# EasyEDA Pro project hardware_project.epro, schematic Schematic4, sheets 1 to 4 of 7

## Sheets
1 ADDA: Board Name: FPGA大赛底板; Create Date: 2026-09-14; Page Name: P1; Project Name: 高速DAC; Schematic Name: Schematic4; Update Date: 2026-09-14; Company: 嘉立创EDA; Drawed: 杨佳乐; Page Size: A4; Version: V1.0
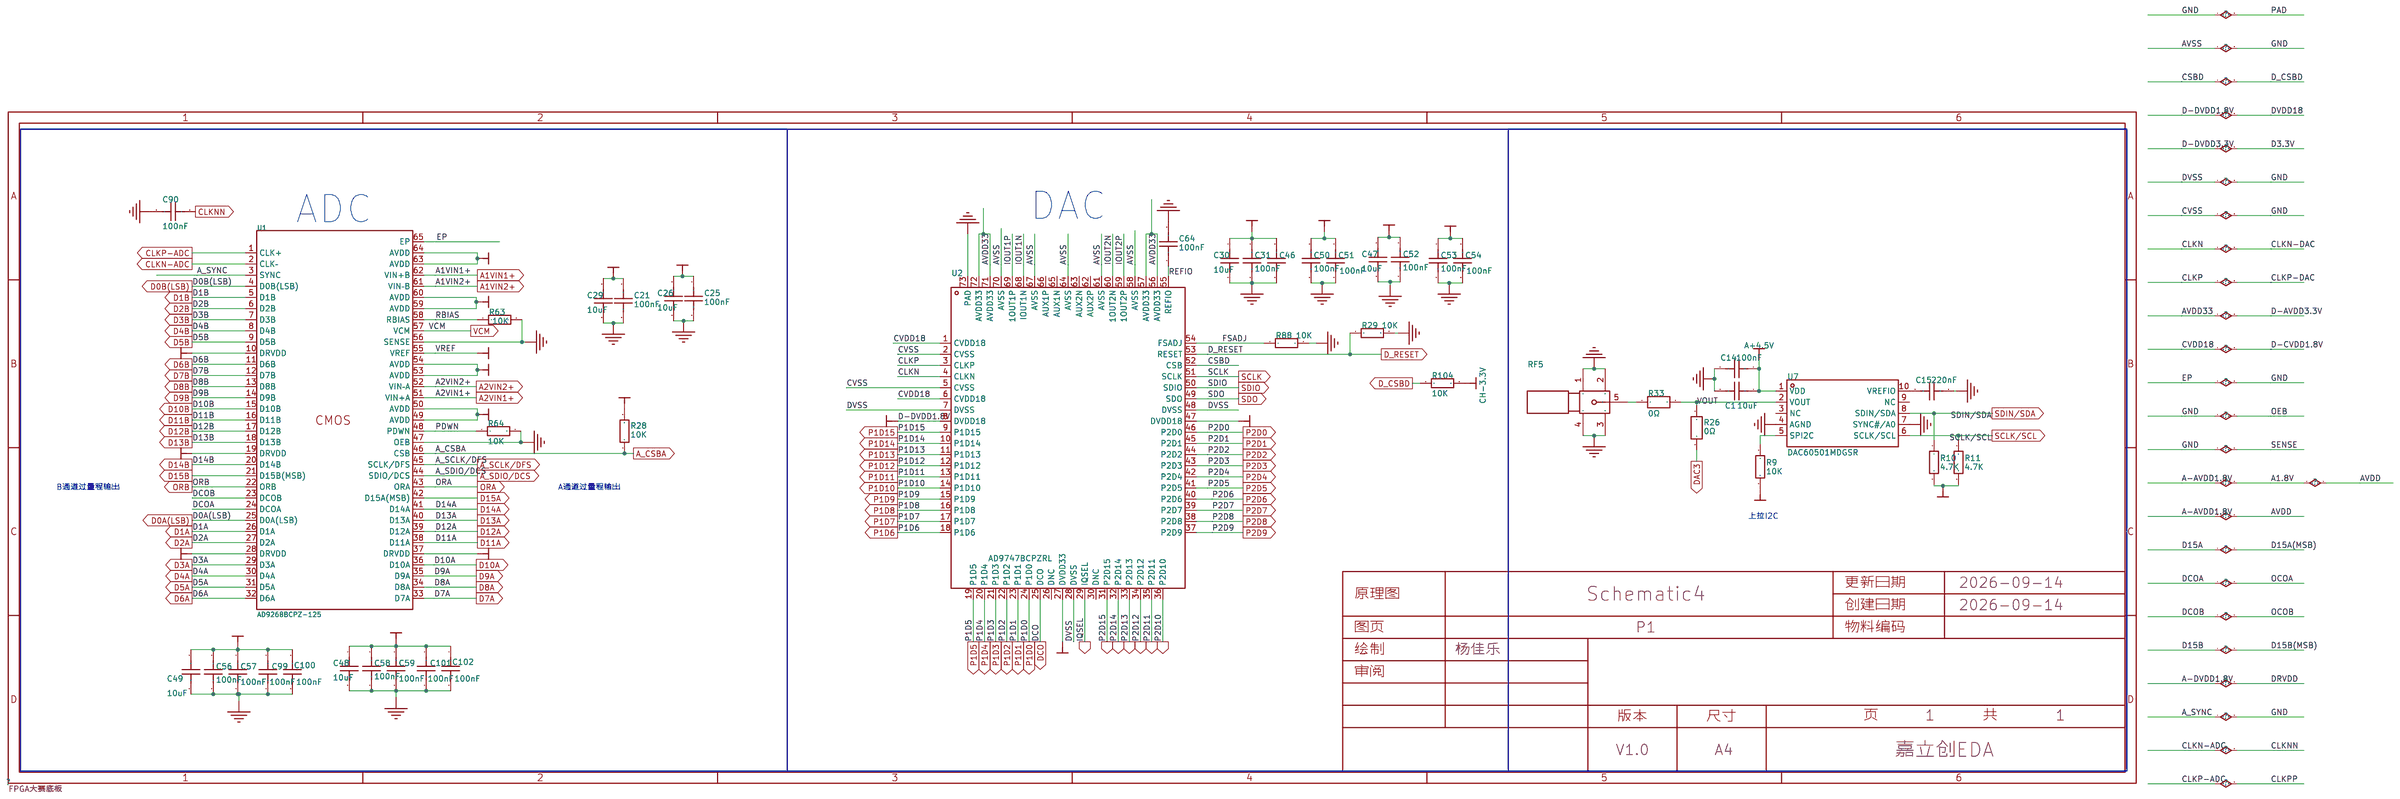
[diagram p0: ADDA]
2 框架: Create Date: 2026-10-14; Update Date: 2026-10-14
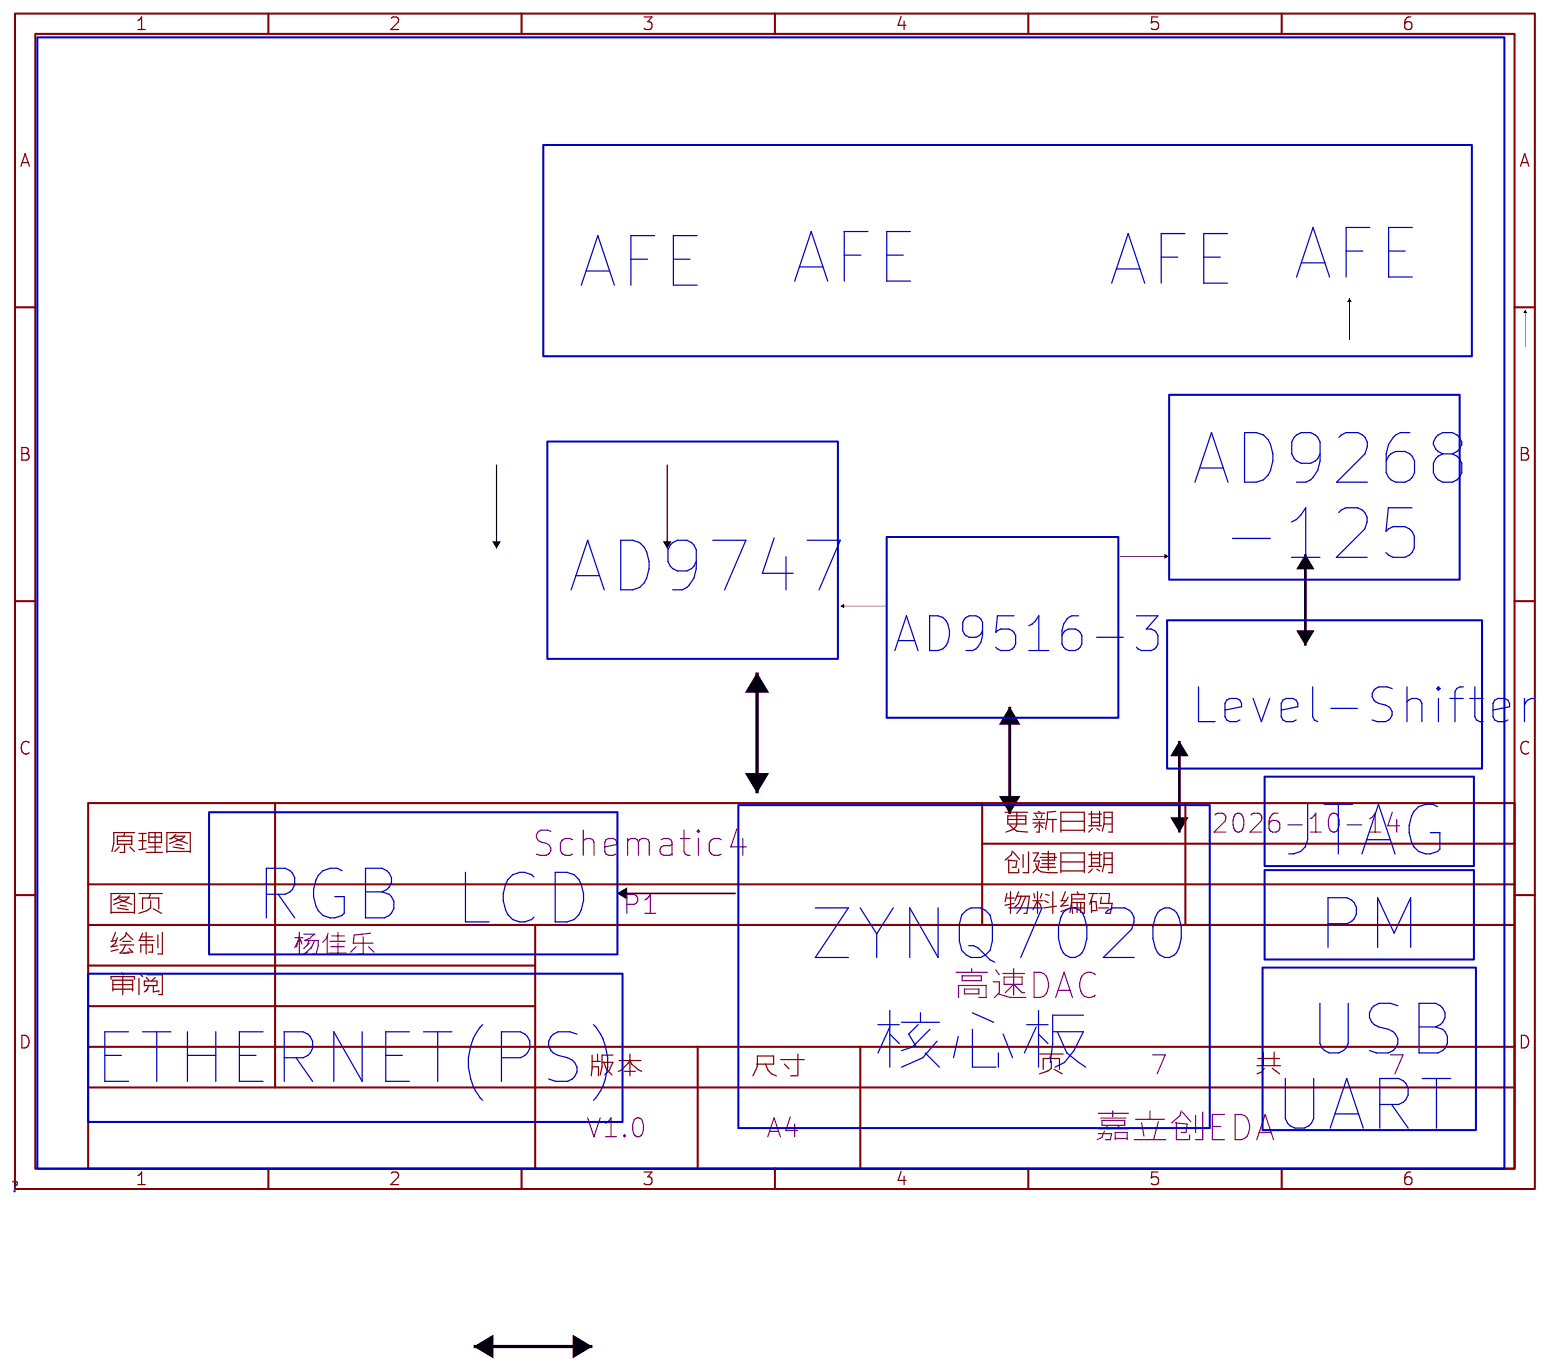
[diagram p1: 框架]
3 POWER: Create Date: 2026-09-28; Update Date: 2026-09-28
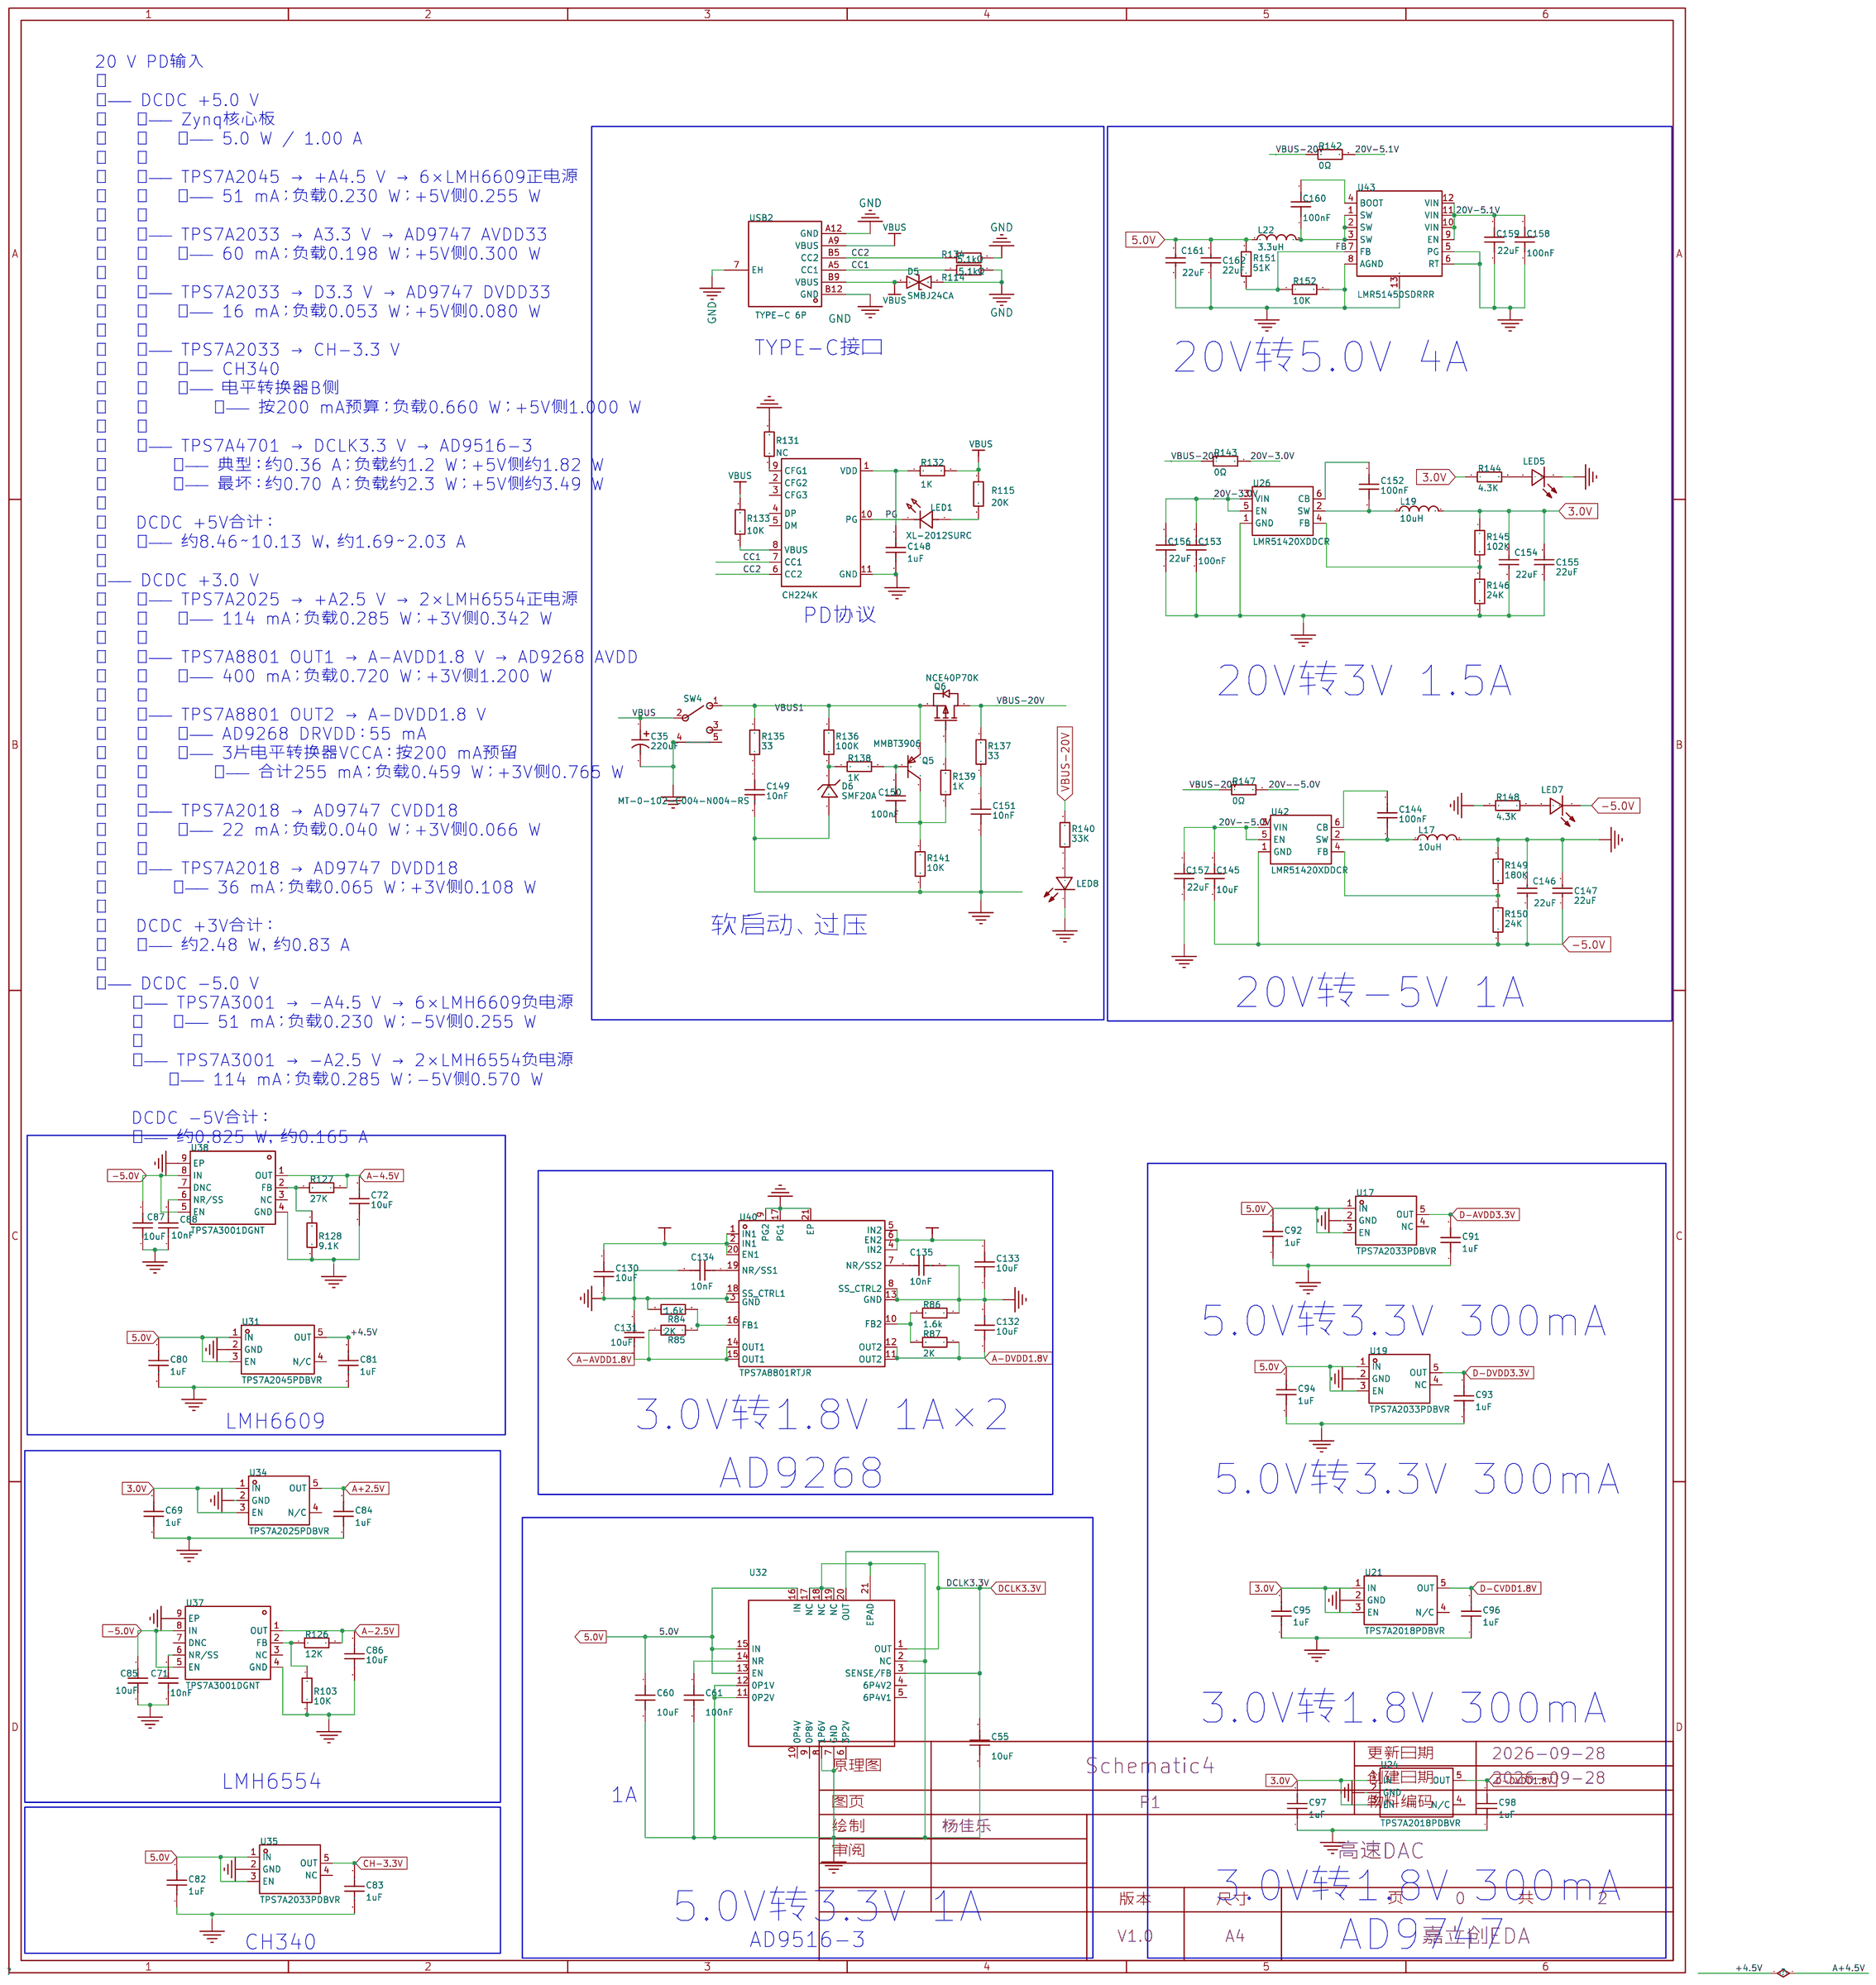
[diagram p2: POWER]
4 核心板: Create Date: 2026-09-28; Page Name: P2; Update Date: 2026-09-28
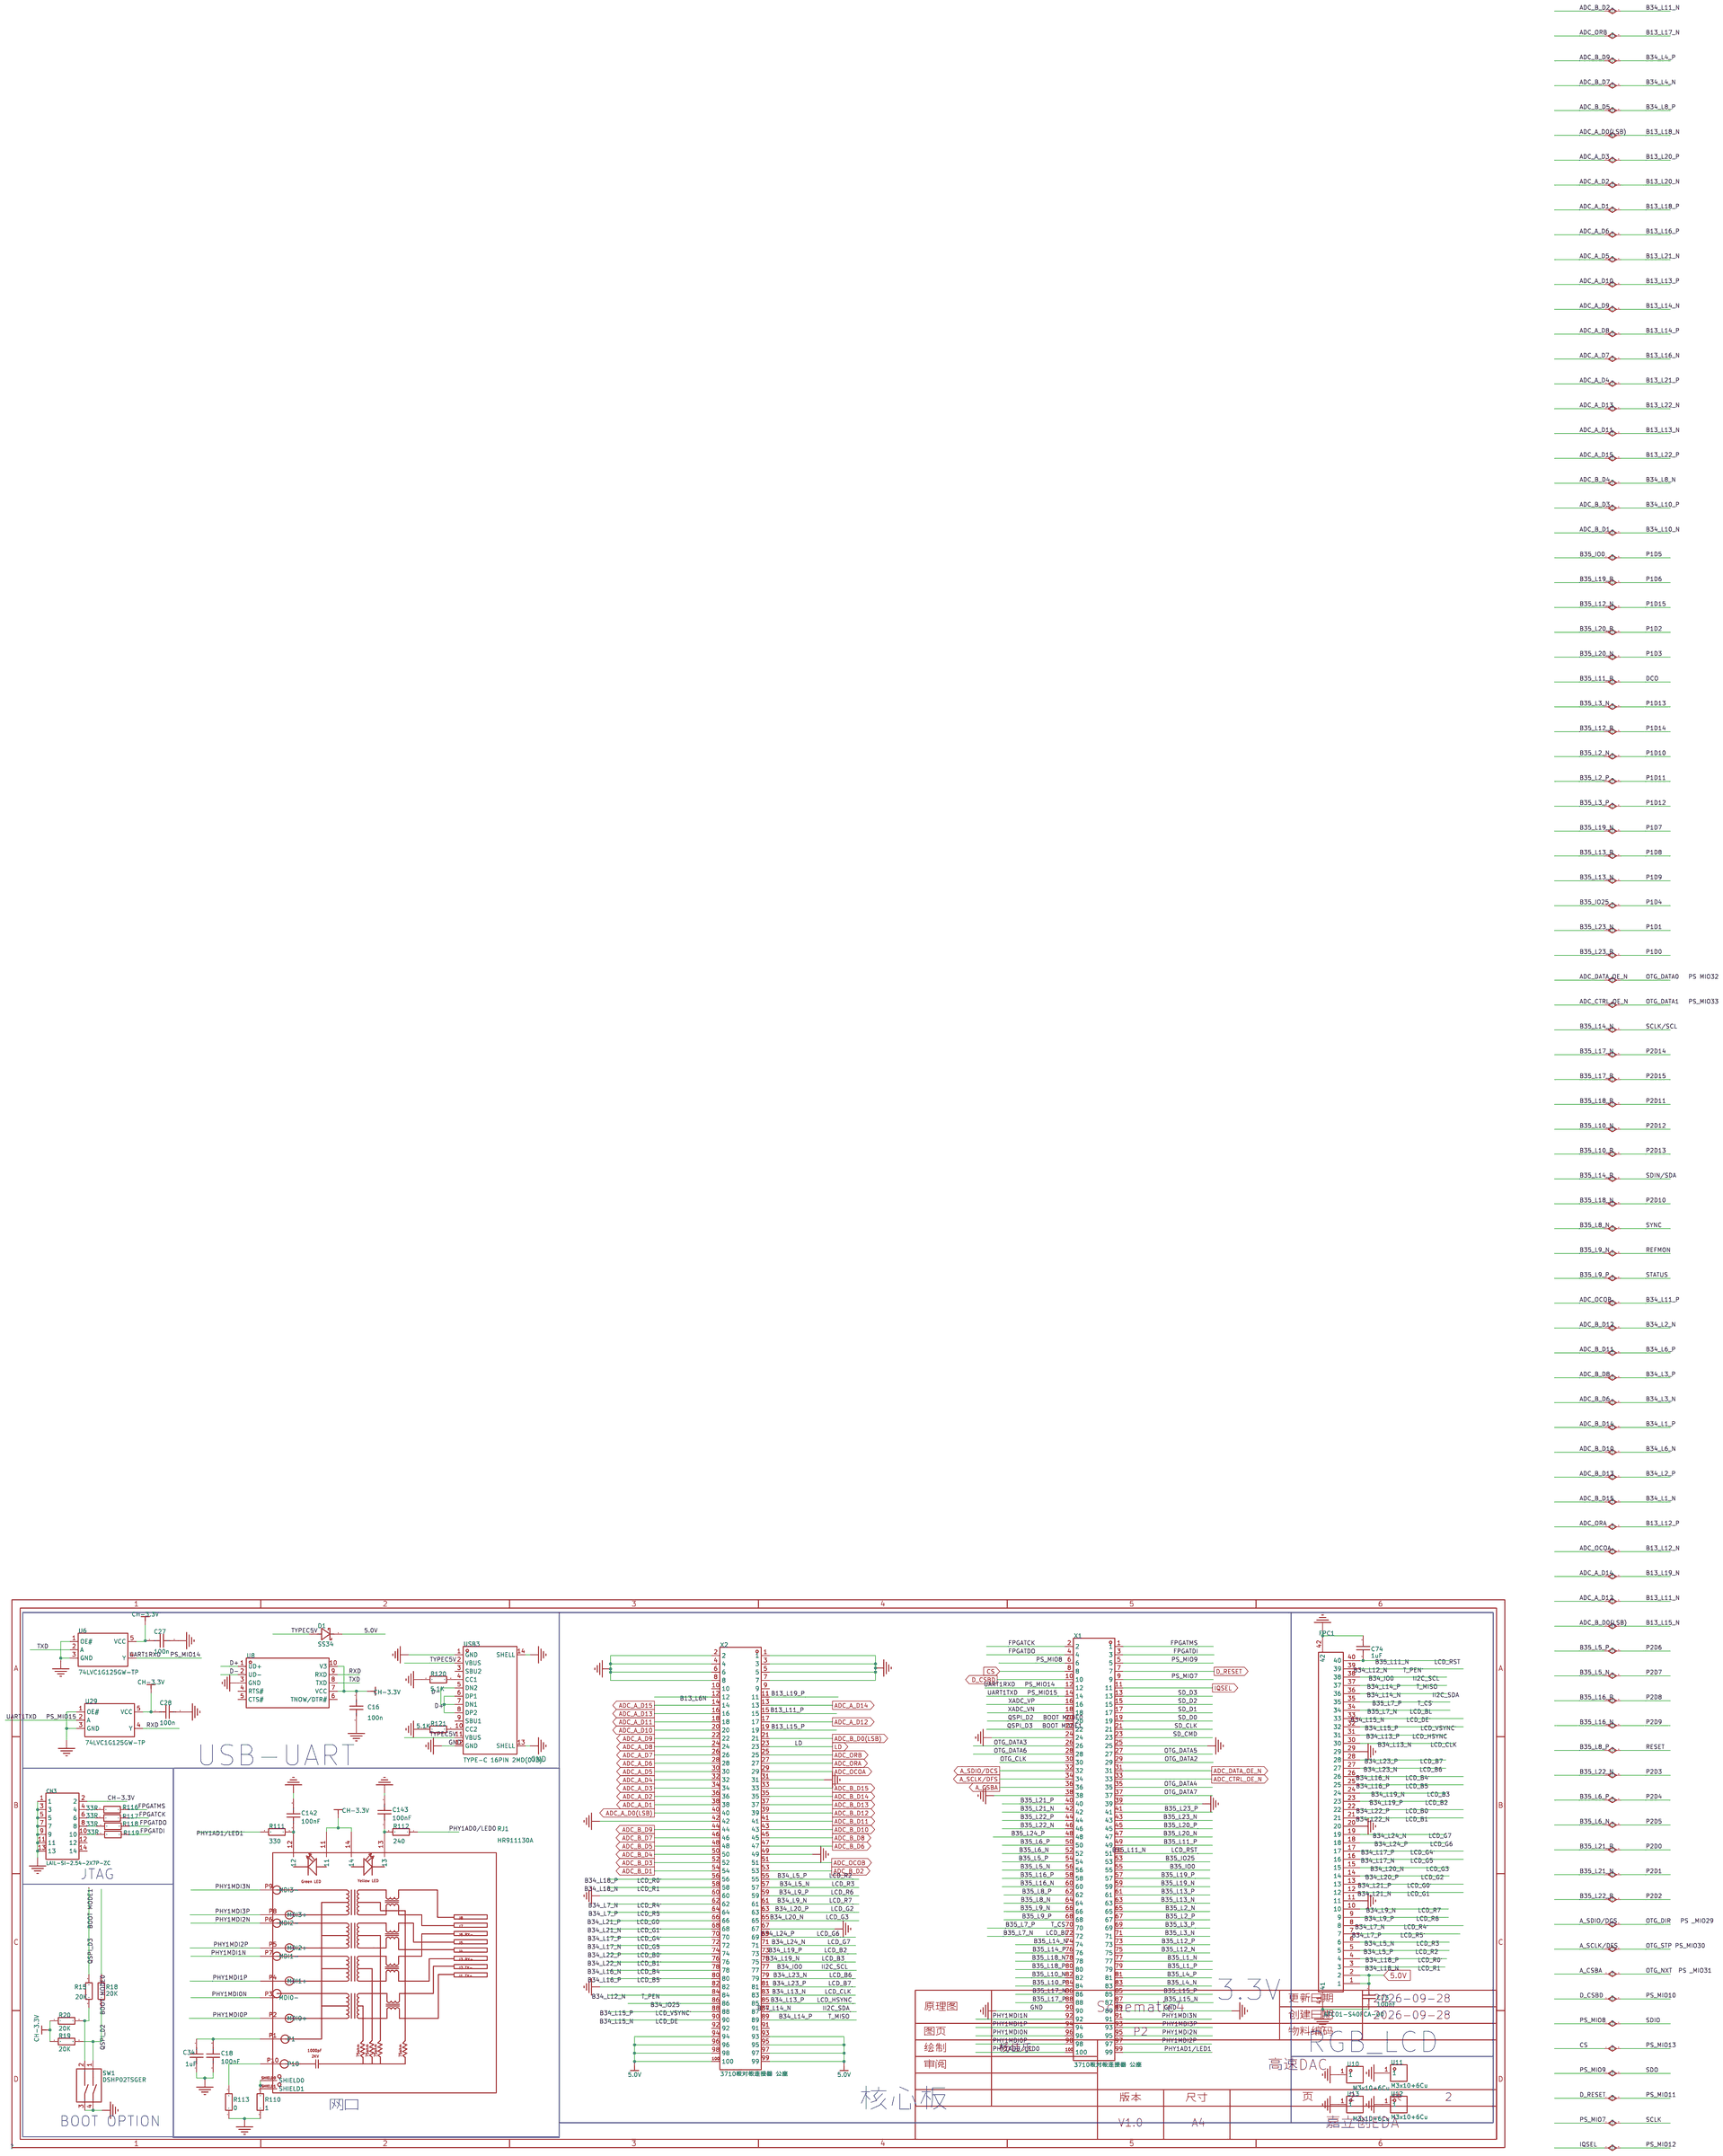
[diagram p3: 核心板]

## Parts
sheet ADDA
C1  10uF  [C0603]
C14  100nF  [C0603]
C15  220nF  [C0603]
C21  100nF  [C0603]
C25  100nF  [C0603]
C26  10uF  [C0603]
C29  10uF  [C0603]
C30  10uF  [C0603]
C31  100nF  [C0603]
C46  100nF  [C0603]
C47  10uF  [C0603]
C48  10uF  [C0603]
C49  10uF  [C0603]
C50  100nF  [C0603]
C51  100nF  [C0603]
C52  100nF  [C0603]
C53  100nF  [C0603]
C54  100nF  [C0603]
C56  100nF  [C0603]
C57  100nF  [C0603]
C58  100nF  [C0603]
C59  100nF  [C0603]
C64  100nF  [C0603]
C90  100nF  [C0603]  (no BOM)
C99  100nF  [C0603]
C100  100nF  [C0603]
C101  100nF  [C0603]
C102  100nF  [C0603]
R9  10K  [R0603]
R10  4.7K  [R0603]
R11  4.7K  [R0603]
R26  0Ω  [R0603]
R28  10K  [R0603]
R29  10K  [R0603]
R33  0Ω  [R0603]
R63  10K  [R0603]
R64  10K  [R0603]
R88  10K  [R0603]
R104  10K  [R0603]
RF5  -  [SMA-SMD_BWSMA-KE-P001]
U1  AD9268BCPZ-125  [LFCSP-64_L9.0-W9.0-P0.50-BL-EP7.5]
U2  AD9747BCPZRL  [LFCSP-72_L10.0-W9.8-P0.50-LS10.2-BL-EP5.5]
U7  DAC60501MDGSR  [VSSOP-10_L3.0-W3.0-P0.50-LS4.9-BL]
sheet POWER
C35  220uF  [CAP-SMD_BD6.3-L6.6-W6.6-FD]
C55  10uF  [C0603]
C60  10uF  [C0603]
C61  100nF  [C0603]
C69  1uF  [C0603]
C71  10nF  [C0603]
C72  10uF  [C0603]
C80  1uF  [C0603]
C81  1uF  [C0603]
C82  1uF  [C0603]
C83  1uF  [C0603]
C84  1uF  [C0603]
C85  10uF  [C0603]
C86  10uF  [C0603]
C87  10uF  [C0603]
C88  10nF  [C0603]
C91  1uF  [C0603]
C92  1uF  [C0603]
C93  1uF  [C0603]
C94  1uF  [C0603]
C95  1uF  [C0603]
C96  1uF  [C0603]
C97  1uF  [C0603]
C98  1uF  [C0603]
C130  10uF  [C0603]
C131  10uF  [C0603]
C132  10uF  [C0603]
C133  10uF  [C0603]
C134  10nF  [C0603]
C135  10nF  [C0603]
C144  100nF  [C0603]
C145  10uF  [C0603]
C146  22uF  [C0603]
C147  22uF  [C0603]
C148  1uF  [C0603]
C149  10nF  [C0603]
C150  100nF  [C0603]
C151  10nF  [C0603]
C152  100nF  [C0603]
C153  100nF  [C0603]
C154  22uF  [C0603]
C155  22uF  [C0603]
C156  22uF  [C0805]
C157  22uF  [C0805]
C158  100nF  [C0603]
C159  22uF  [C0805]
C160  100nF  [C0603]
C161  22uF  [C0603]
C162  22uF  [C0603]
D5  SMBJ24CA  [SMB_L4.6-W3.6-LS5.3-BI]
D6  SMF20A  [SOD-123F_L2.8-W1.8-LS3.7-RD]
L17  10uH  [IND-SMD_L3.0-W3.0]
L19  10uH  [IND-SMD_L3.0-W3.0]
L22  3.3uH  [IND-SMD_L5.5-W5.3_APS0530M3R3H]
LED1  XL-2012SURC  [LED0603-RD_WHITE]
LED5  NCD0603Y2  [LED0603-RD]
LED7  NCD0603Y2  [LED0603-RD]
LED8  NCD0603Y2  [LED0603-RD]
Q5  MMBT3906  [SOT-23-3_L2.9-W1.3-P1.90-LS2.4-BR]
Q6  NCE40P70K  [TO-252-2_L6.6-W6.1-P4.57-LS9.9-TL-CW]
R84  1.6k  [R0603]
R85  2K  [R0603]
R86  1.6k  [R0603]
R87  2K  [R0603]
R103  10K  [R0603]
R114  5.1kΩ  [R0603]
R115  20K  [R0603]
R126  12K  [R0603]
R127  27K  [R0603]
R128  9.1K  [R0603]
R131  NC  [R0603]
R132  1K  [R0603]
R133  10K  [R0603]
R134  5.1kΩ  [R0603]
R135  33  [R0603]
R136  100K  [R0603]
R137  33  [R0603]
R138  1K  [R0603]
R139  1K  [R0603]
R140  33K  [R0603]
R141  10K  [R0603]
R142  0Ω  [R0603]
R143  0Ω  [R0603]
R144  4.3K  [R0603]
R145  102K  [R0603]
R146  24K  [R0603]
R147  0Ω  [R0603]
R148  4.3K  [R0603]
R149  180K  [R0603]
R150  24K  [R0603]
R151  51K  [R0603]
R152  10K  [R0603]
SW4  MT-0-102-C004-N004-RS  [SW-TH_MT-0-102-C004-N004-RS]
U17  TPS7A2033PDBVR  [SOT-23-5_L2.9-W1.6-P0.95-LS2.8-BR]
U19  TPS7A2033PDBVR  [SOT-23-5_L2.9-W1.6-P0.95-LS2.8-BR]
U21  TPS7A2018PDBVR  [TSOT-23-5_L2.9-W1.6-P0.95-LS2.8-BL]
U24  TPS7A2018PDBVR  [TSOT-23-5_L2.9-W1.6-P0.95-LS2.8-BL]
U25  CH224K  [ESSOP-10_L4.9-W3.9-P1.0-LS6.0-TL-EP]
U26  LMR51420XDDCR  [SOT-23-6_L2.9-W1.6-P0.95-LS2.8-BL]
U31  TPS7A2045PDBVR  [SOT-23-5_L2.9-W1.6-P0.95-LS2.8-BR]
U32  TPS7A4701RGWR  [VQFN-20_L5.0-W5.0-P0.65-TL-EP]
U34  TPS7A2025PDBVR  [SOT-23-5_L2.9-W1.6-P0.95-LS2.8-BR]
U35  TPS7A2033PDBVR  [SOT-23-5_L2.9-W1.6-P0.95-LS2.8-BR]
U37  TPS7A3001DGNT  [HVSSOP-8_L3.0-W3.0-P0.65-LS4.9-BL-EP_DGN0008D]
U38  TPS7A3001DGNT  [HVSSOP-8_L3.0-W3.0-P0.65-LS4.9-BL-EP_DGN0008D]
U40  TPS7A8801RTJR  [LFCSP-20_L4.0-W4.0-P0.50-BL-EP]
U42  LMR51420XDDCR  [SOT-23-6_L2.9-W1.6-P0.95-LS2.8-BL]
U43  LMR51450SDRRR  [WSON-12_L3.0-W3.0-P0.50-TL-EP-2]
USB2  TYPE-C 6P  [TYPE-C-SMD_TYPE-C-6P]
sheet 核心板
C16  100n  [C0603]
C18  100nF  [C0603]
C27  100n  [C0603]
C28  100n  [C0603]
C34  1uF  [C0603]
C73  100nF  [C0603]
C74  1uF  [C0603]
C142  100nF  [C0603]
C143  100nF  [C0603]
CN3  LAIL-SI-2.54-2X7P-ZC  [IDC-TH_14P-P2.54-V-M-R2-C7-S2.54]
D1  SS34  [SMA_L4.3-W2.6-LS5.0-FD]
FPC1  AFC01-S40FCA-00  [FPC-SMD_AFC01-S40FCA-00]
R15  20K  [R0603]
R18  20K  [R0603]
R19  20K  [R0603]
R20  20K  [R0603]
R110  1  [R0603]
R111  330  [R0603]
R112  240  [R0603]
R113  0  [R0603]
R116  33R  [R0603]
R117  33R  [R0603]
R118  33R  [R0603]
R119  33R  [R0603]
R120  5.1K  [R0603]
R121  5.1K  [R0603]
RJ1  HR911130A  [RJ45-TH_HR911130A]
SW1  DSHP02TSGER  [SW-SMD_DSHP02TSGER]
U6  74LVC1G125GW-TP  [SC-70-5_L2.1-W1.3-P0.65-LS2.1-BR]
U8  CH340X  [MSOP-10_L3.0-W3.0-P0.50-LS5.0-BL]
U10  M3x10+6Cu  [SMD_L4.7-W4.7-D3.0]
U11  M3x10+6Cu  [SMD_L4.7-W4.7-D3.0]
U12  M3x10+6Cu  [SMD_L4.7-W4.7-D3.0]
U13  M3x10+6Cu  [SMD_L4.7-W4.7-D3.0]
U29  74LVC1G125GW-TP  [SC-70-5_L2.1-W1.3-P0.65-LS2.1-BR]
USB3  TYPE-C 16PIN 2MD(073)  [USB-C-SMD_TYPE-C-6PIN-2MD-073]
X1  3710板对板连接器 公座  [CONN-SMD_100P-P0.80_61083-101402LF]
X2  3710板对板连接器 公座  [CONN-SMD_100P-P0.80_61083-101402LF]

## Library data of the parts
C1 C14-C16 C18 C21 C25-C31 C34 C46-C54 C56-C59 C64 C69 C71 C72 C80-C88 C90-C102 C130-C135 C142 C143 C148 = CAP_0603: Supplier Footprint: 0603
R9-R11 R15 R18-R20 R28 R29 R63 R64 R84-R88 R104 R110-R121 R131-R134 = Res_0603: Supplier Footprint: 0603
R26 R33 = FRC0603F0000TS: 电阻类型:厚膜电阻;阻值:0Ω;精度:±1%;功率:100mW;工作电压:75V;; LCSC Part Name: 0Ω ±1% 100mW 厚膜电阻; Supplier Part: C2906974; Manufacturer: FOJAN(富捷); Supplier Footprint: 0603; JLCPCB Part Class: Extended Part; Supplier: LCSC; Type: 厚膜电阻; Tolerance: ±1%; Power(Watts): 100mW; Voltage-Supply(Max): 75V; Operating Temperature: -55℃~+155℃
RF5 = BWSMA-KE-P001: 连接器类型:板端;接口类型:内孔;端口数量:1;接口直径:5.2mm;接口长度/高度:-;频率:-;射频系列:SMA;阻抗:50Ω;样式:偏脚;工作温度:-;; LCSC Part Name: 内孔 SMA 偏脚; Supplier Part: C496550; Manufacturer: BAT WIRELESS(蝙蝠无线); Supplier Footprint: SMD; JLCPCB Part Class: Extended Part; Datasheet: https://item.szlcsc.com/datasheet/BWSMA-KE-P001/508499.html; Supplier: LCSC; Connector Type: 板端; Interface: 内孔; Number of Ports: 1; Interface Diameter: 5.2mm; RF Series: SMA; Impedance: 50Ω; Style: 偏脚
U1 = AD9268BCPZ-80: Supplier Part: C2903965; Manufacturer: ADI(亚德诺); Supplier Footprint: LFCSP-64; JLCPCB Part Class: Extended Part; Supplier: LCSC
U2 = AD9747BCPZRL: 分辨率(位):16位;接口类型:SPI;工作电压:1.8V~3.3V;建立时间:-;积分非线性:4LSB;; LCSC Part Name: 双通道、16-Bit、250 MSPS数模转换器(DAC); Supplier Part: C514297; Manufacturer: ADI(亚德诺); Supplier Footprint: LFCSP-72(10x10); JLCPCB Part Class: Extended Part; Datasheet: https://item.szlcsc.com/datasheet/AD9747BCPZRL/529338.html; Supplier: LCSC; Resolution (Bits): 16位; Number of Channels: 2; Interface: SPI; Voltage - Supply: 1.8V~3.3V; Integral non - linearity: 4LSB; Operating Temperature: -40℃~+85℃; Function: 可编程增益；掉电模式；差分输出；软复位；内置基准源
U7 = DAC60501MDGSR: 分辨率:12位;接口类型:SPI；I2C;工作电压:2.7V~5.5V;稳定时间:5us;积分非线性:1LSB;; LCSC Part Name: 具有精密内部基准的DACx0501位电压输出DAC; Supplier Part: C1852028; Manufacturer: TI(德州仪器); Supplier Footprint: VSSOP-10-0.5mm; JLCPCB Part Class: Extended Part; Datasheet: https://www.ti.com/cn/lit/gpn/dac60501; Supplier: LCSC; Resolution(Bits): 12位; Number of Channels: 1; Interface: SPI；I2C; Voltage - Supply: 2.7V~5.5V; Settling Time: 5us; Output Type: 电压-缓冲; Integral non - linearity: 1LSB; Operating Temperature: -40℃~+125℃; Power-On Reset: 内置; Voltage Reference: 内置; Voltage Reference Drift: 5ppm/℃; Data rate: 1MHz；50MHz；100kHz；400kHz; Supply Current (Iq): 15uA
C35 = JVJ35V220M6x8: 容值:220uF;精度:±20%;额定电压:35V;纹波电流:190mA@120Hz;; LCSC Part Name: 220uF ±20% 35V; Supplier Part: C46550411; Manufacturer: JIERR(捷而瑞); Supplier Footprint: SMD,D6.3xL7.7mm; JLCPCB Part Class: Extended Part; Datasheet: https://item.szlcsc.com/datasheet/JVJ35V220M6x8/48680105.html; Supplier: LCSC; Tolerance: ±20%; Voltage Rating: 35V; Ripple Current: 190mA@120Hz; Diameter: 6.3mm; Height - Seated (Max): 7.7mm; Lifetime: 2000hrs@105℃; Operating Temperature: -55℃~+105℃
C55 C60 C61 C73 C74 C144-C147 C149-C155 C158 C160-C162 = FCC0603B104K500CT: 容值:100nF;精度:±10%;额定电压:50V;温度系数:X7R;; LCSC Part Name: 100nF ±10% 50V; Supplier Part: C5137636; Manufacturer: FOJAN(富捷); Supplier Footprint: 0603; JLCPCB Part Class: Extended Part; Datasheet: https://item.szlcsc.com/datasheet/FCC0603B104K500CT/5747088.html; Supplier: LCSC; Tolerance: ±10%; Voltage Rating: 50V; Temperature Coefficient: X7R
C156 C157 C159 = CGA0805X5R226M350MT: 容值:22uF;精度:±20%;额定电压:35V;温度系数:X5R;; LCSC Part Name: 22uF ±20% 35V; Supplier Part: C6119901; Manufacturer: HRE(芯声); Supplier Footprint: 0805; JLCPCB Part Class: Extended Part; Datasheet: https://item.szlcsc.com/datasheet/CGA0805X5R226M350MT/7062607.html; Supplier: LCSC; Tolerance: ±20%; Voltage Rating: 35V; Temperature Coefficient: X5R
D5 = SMBJ24CA_C83268: 极性:双向;反向截止电压(Vrwm):24V;钳位电压:38.9V;峰值脉冲电流(Ipp):15.5A;峰值脉冲功率(Ppp):600W;击穿电压:26.7V;; LCSC Part Name: 双向TVS 24V截止 峰值浪涌电流：15.5A; Supplier Part: C83268; Manufacturer: Littelfuse(美国力特); Supplier Footprint: DO-214AA; JLCPCB Part Class: Extended Part; Datasheet: https://item.szlcsc.com/datasheet/SMBJ24CA/84432.html; Supplier: LCSC; Polarity: 双向; Reverse Stand-Off Voltage (Vrwm): 24V; Clamping Voltage: 38.9V; Peak Pulse Current (Ipp): 15.5A; Peak Pulse Power Dissipation (Ppp): 600W; Voltage - Breakdown: 26.7V; Reverse Leakage Current (Ir): 1uA; Operating Temperature: -65℃~+150℃; level of protection: IEC 61000-4-4；IEC 61000-4-2; Type: TVS
D6 = SMF20A_C151295: 反向截止电压(Vrwm):20V;钳位电压:32.4V;峰值脉冲电流(Ipp):6.2A@10/1000us;峰值脉冲功率(Ppp):200W@10/1000us;击穿电压:24.5V;; LCSC Part Name: TVS 20V截止 峰值浪涌电流：6.2A@10/1000us; Supplier Part: C151295; Manufacturer: Littelfuse(美国力特); Supplier Footprint: SOD-123FL; JLCPCB Part Class: Extended Part; Datasheet: https://item.szlcsc.com/datasheet/SMF20A/162635.html; Supplier: LCSC; Reverse Stand-Off Voltage (Vrwm): 20V; Clamping Voltage: 32.4V; Peak Pulse Current (Ipp): 6.2A@10/1000us; Peak Pulse Power Dissipation (Ppp): 200W@10/1000us; Voltage - Breakdown: 24.5V; Reverse Leakage Current (Ir): 1uA; Operating Temperature: -65℃~+150℃; level of protection: IEC 61000-4-2; Type: TVS
L17 L19 = SLO0320T100MTT: 电感值:10uH;精度:±20%;; LCSC Part Name: SMD 10uH 0320 2.2A ±20%; Supplier Part: C42924315; Manufacturer: Sunltech(顺磁); Supplier Footprint: SMD,3x3mm; Datasheet: https://item.szlcsc.com/datasheet/SLO0320T100MTT/45024709.html; Supplier: LCSC; Tolerance: ±20%
L22 = APS0530M3R3H: 电感值:3.3uH;精度:±20%;额定电流:5A;饱和电流(Isat):8A;; LCSC Part Name: 3.3uH ±20%; Supplier Part: C49073587; Manufacturer: Coilank(驰兴电感); Supplier Footprint: SMD,5.5x5.3mm; JLCPCB Part Class: Extended Part; Datasheet: https://item.szlcsc.com/datasheet/APS0530M3R3H/51448248.html; Supplier: LCSC; Tolerance: ±20%; Current Rating: 5A; Current - Saturation(Isat): 8A; DC Resistance(DCR): 38mΩ
LED1 = XL-2012SURC: 发光颜色:红色;功率:55mW;正向电流:25mA;主波长:617nm~621nm;透镜颜色:无色透明透镜;色温:-;发光角度:120°;载带方式:正贴;工作温度:-30℃~+85℃;; Supplier Part: C965812; Manufacturer: XINGLIGHT(成兴光); Supplier Footprint: 0805; JLCPCB Part Class: 扩展库; Datasheet: https://atta.szlcsc.com/upload/public/pdf/source/20221102/49E1A0A365644091E6270AF1C5E0FE37.pdf; Supplier: LCSC; Emitted Color: 红色; Power Dissipation: 55mW; Forward Current: 25mA; Dominant Wavelength: 617nm~621nm; Peak Wavelength: 623nm; Lens Color: 无色透明透镜; Viewing Angle: 120°; Mounting Sytle: 正贴; Operating Temperature: -30℃~+85℃
LED5 LED7 LED8 = NCD0603Y2: 发光颜色:黄色;正向电压(VF):1.6V~2.6V;功率:65mW;正向电流:20mA;主波长:586nm~595nm;透镜颜色:无色透明透镜;发光强度:100mcd~220mcd;发光角度:130°;工作温度:-30℃~+85℃;; Supplier Part: C89811; Manufacturer: 国星光电; Supplier Footprint: 0603; JLCPCB Part Class: 扩展库; Datasheet: https://atta.szlcsc.com/upload/public/pdf/source/20200820/C89811_7FE84B429B6BCA3E113B125EE1452576.pdf; Supplier: LCSC; Emitted Color: 黄色; Forward Voltage (VF): 1.6V~2.6V; Power Dissipation: 65mW; Forward Current: 20mA; Dominant Wavelength: 586nm~595nm; Lens Color: 无色透明透镜; Luminous Intensity: 100mcd~220mcd; Viewing Angle: 130°; Operating Temperature: -30℃~+85℃
Q5 = MMBT3906_C7420354: 晶体管类型:PNP;集电极电流(Ic):200mA;集射极击穿电压(Vceo):40V;耗散功率(Pd):200mW;直流电流增益(hFE):100@10mA,1.0V;; LCSC Part Name: PNP 电流:200mA 电压:40V; Supplier Part: C7420354; Manufacturer: R+O(宏嘉诚); Supplier Footprint: SOT-23; JLCPCB Part Class: Extended Part; Datasheet: https://item.szlcsc.com/datasheet/MMBT3906/8397176.html; Supplier: LCSC; type: PNP; Current - Collector(Ic): 200mA; Collector - Emitter Voltage VCEO: 40V; Pd - Power Dissipation: 200mW; DC Current Gain: 100@10mA,1.0V; Transition frequency(fT): 300MHz; Current - Collector Cutoff: 100nA; Vce Saturation(VCE(sat)): 300mV; Operating Temperature: -55℃~+150℃; Emitter-Base Voltage(Vebo): 5V
Q6 = NCE40P70K: 类型:P沟道;漏源电压(Vdss):40V;连续漏极电流(Id):70A;功率(Pd):130W;导通电阻(RDS(on)@Vgs,Id):10mΩ@10V,20A;阈值电压(Vgs(th)@Id):2.5V@250uA;; LCSC Part Name: P沟道 耐压:40V 电流:70A; Supplier Part: C130101; Manufacturer: NCE(无锡新洁能); Supplier Footprint: TO-252-2(DPAK); JLCPCB Part Class: 扩展库; Datasheet: https://atta.szlcsc.com/upload/public/pdf/source/20170919/C130101_1505787178833976874.pdf; Supplier: LCSC; Type: P沟道; Drain Source Voltage (Vdss): 40V; Continuous Drain Current (Id): 70A; Power Dissipation (Pd): 130W; Drain Source On Resistance (RDS(on)@Vgs,Id): 10mΩ@10V,20A; Gate Threshold Voltage (Vgs(th)@Id): 2.5V@250uA
R103 R126-R128 R135-R141 R144-R146 R148-R152 = FRC0603F1003TS: 电阻类型:厚膜电阻;阻值:100kΩ;精度:±1%;功率:100mW;工作电压:75V;温度系数:±100ppm/℃;; LCSC Part Name: 100kΩ ±1% 100mW 厚膜电阻; Supplier Part: C2906980; Manufacturer: FOJAN(富捷); Supplier Footprint: 0603; JLCPCB Part Class: Extended Part; Datasheet: https://item.szlcsc.com/datasheet/FRC0603F1003TS/3180493.html; Supplier: LCSC; Type: 厚膜电阻; Tolerance: ±1%; Power(Watts): 100mW; Voltage-Supply(Max): 75V; Temperature Coefficient: ±100ppm/℃; Operating Temperature: -55℃~+155℃
R142 R143 R147 = FRC0603F1003TS: 电阻类型:厚膜电阻;阻值:0Ω;精度:±1%;功率:100mW;工作电压:75V;温度系数:-;; LCSC Part Name: 厚膜电阻 0Ω ±1% 100mW; Supplier Part: C100044; Manufacturer: YAGEO(国巨); Manufacturer Part: RC0603FR-070RL; Supplier Footprint: 0603; JLCPCB Part Class: Extended Part; Datasheet: https://item.szlcsc.com/datasheet/RC0603FR-070RL/101258.html; Supplier: LCSC; Type: 厚膜电阻; Tolerance: ±1%; Power(Watts): 100mW; Voltage-Supply(Max): 75V; Operating Temperature: -55℃~+155℃
SW4 = MT-0-102-C004-N004-RS: 电路结构:单刀双掷;机械寿命:-;额定电流:5A;额定电压(AC):125V;安装方式:弯插;; LCSC Part Name: 小型钮子三脚二档(侧弯脚); Supplier Part: C1788496; Manufacturer: YUEN FUNG(源丰); Supplier Footprint: 插件; JLCPCB Part Class: 扩展库; Datasheet: https://atta.szlcsc.com/upload/public/pdf/source/20201225/C1788496_4A510216A5AB92F9A610F801A4D646B0.pdf; Supplier: LCSC; Circuit: 单刀双掷; Switch Length: 13.1mm; Switch Width: 8mm; Contact Current: 5A; Voltage Rating (AC): 125V; Actuator Type: 圆柱钮柄; Pin Style: PC引脚; Mounting Style: 弯插; Operating Temperature: -25℃~+85℃
U17 U19 U35 = TPS7A2033PDBVR: 输出极性:正极;工作电压:6V;输出电压:3.3V;输出电流:300mA;电源纹波抑制比(PSRR):65dB@(100kHz);输出类型:固定;; LCSC Part Name: 3.3V 300mA 6V; Supplier Part: C2862740; Manufacturer: TI(德州仪器); Supplier Footprint: SOT-23-5; JLCPCB Part Class: Extended Part; Datasheet: https://www.ti.com/cn/lit/ds/symlink/tps7a20.pdf; Supplier: LCSC; Output Configuration: 正极; Voltage - Supply: 6V; Output Voltage: 3.3V; Output Current: 300mA; Power Supply Rejection Ratio (PSRR): 65dB@(100kHz); Voltage Dropout: 140mV@(300mA); standby current: 8.5uA; Noise: 10uVrms; Features: 使能控制；内置软启动；过流保护；短路保护；输出放电；热关断；输入欠压保护; Operating Temperature: -40℃~+125℃@(Tj); Output Type: 固定; Number of Outputs: 1
U21 U24 = TPS7A2018PDBVR: 输出极性:正极;工作电压:6V;输出电压:1.8V;输出电流:300mA;电源纹波抑制比(PSRR):92dB@(1kHz);输出类型:固定;; LCSC Part Name: 1.8V 300mA 6V; Supplier Part: C963430; Manufacturer: TI(德州仪器); Supplier Footprint: SOT-23-5L; JLCPCB Part Class: Extended Part; Datasheet: https://www.ti.com/cn/lit/ds/symlink/tps7a20.pdf; Supplier: LCSC; Output Configuration: 正极; Voltage - Supply: 6V; Output Voltage: 1.8V; Output Current: 300mA; Power Supply Rejection Ratio (PSRR): 92dB@(1kHz); Voltage Dropout: 200mV@(300mA); standby current: 6.5uA; Noise: 10uVrms; Features: 短路保护；使能控制；输入欠压保护；内置软启动；过流保护；输出放电；热关断; Operating Temperature: -40℃~+125℃@(Tj); Output Type: 固定; Number of Outputs: 1
U25 = CH224K: LCSC Part Name: USBPD等多快充协议受电芯片CH224; Supplier Part: C970725; Manufacturer: WCH(南京沁恒); Supplier Footprint: ESSOP-10-150mil-1mm; JLCPCB Part Class: 扩展库; Datasheet: https://atta.szlcsc.com/upload/public/pdf/source/20240313/43C2AFDDBDD1F65B60386D2CCAB0811B.pdf; Supplier: LCSC
U26 U42 = LMR51420XDDCR: 功能类型:降压型;输出类型:可调;工作电压:4.5V~36V;输出电压:600mV~34.2V;输出电流:2A;; Supplier Part: C5246146; Manufacturer: TI(德州仪器); Supplier Footprint: SOT-23-6; JLCPCB Part Class: Extended Part; Datasheet: https://item.szlcsc.com/datasheet/LMR51420XDDCR/5955992.html; Supplier: LCSC; Function: 降压型; Output Type: 可调; Voltage - Supply: 4.5V~36V; Output Voltage: 600mV~34.2V; Output Current: 2A; Frequency - Switching: 500kHz; Operating Temperature: -40℃~+150℃@(TJ); Synchronous Rectifier: 是; Number of Outputs: 1; Topology: 降压式; Switch tube (built-in/external): 内置
U31 = TPS7A2045PDBVR: 输出极性:正极;工作电压:6V;输出电压:4.5V;输出电流:300mA;电源纹波抑制比(PSRR):92dB@(1kHz);输出类型:固定;; LCSC Part Name: 4.5V 300mA 6V; Supplier Part: C2873627; Manufacturer: TI(德州仪器); Supplier Footprint: SOT-23-5; JLCPCB Part Class: Extended Part; Datasheet: https://www.ti.com/cn/lit/ds/symlink/tps7a20.pdf; Supplier: LCSC; Output Configuration: 正极; Voltage - Supply: 6V; Output Voltage: 4.5V; Output Current: 300mA; Power Supply Rejection Ratio (PSRR): 92dB@(1kHz); Voltage Dropout: 140mV@(300mA); standby current: 8.5uA; Noise: 10uVrms; Features: 使能控制；输入欠压保护；内置软启动；短路保护；过流保护；输出放电；热关断; Operating Temperature: -40℃~+125℃@(Tj); Output Type: 固定; Number of Outputs: 1
U32 = TPS7A4701RGWR: 输出类型:可调;最大输入电压:35V;输出电压:1.4V~34V;输出电流:1A;电源纹波抑制比(PSRR):78dB@(1kHz);输出极性:正极;; LCSC Part Name: 具有使能功能的 1A、36V、低噪声、高 PSRR、低压降稳压器; Supplier Part: C90084; Manufacturer: TI(德州仪器); Supplier Footprint: VQFN-20-EP(5x5); JLCPCB Part Class: 扩展库; Datasheet: https://www.ti.com/cn/lit/gpn/tps7a47; Supplier: LCSC; Output Type: 可调; Maximum Input Voltage: 35V; Output Voltage: 1.4V~34V; Output Current: 1A; Power Supply Rejection Ratio (PSRR): 78dB@(1kHz); Dropout Voltage: 450mV@(1A); standby current: 1mA; Noise: 4.67uVrms; Feature: 过流保护(OCP)；低ESR；热保护(TSD)；防静电保护；浪涌保护；欠压闭锁；带使能; Output Polarity: 正极; Number of Outputs: 1
U34 = TPS7A2025PDBVR: 输出极性:正极;工作电压:6V;输出电压:2.5V;输出电流:300mA;电源纹波抑制比(PSRR):92dB@(1kHz);输出类型:固定;; LCSC Part Name: 2.5V 300mA 6V; Supplier Part: C2869949; Manufacturer: TI(德州仪器); Supplier Footprint: SOT-23-5; JLCPCB Part Class: Extended Part; Datasheet: https://www.ti.com/cn/lit/ds/symlink/tps7a20.pdf; Supplier: LCSC; Output Configuration: 正极; Voltage - Supply: 6V; Output Voltage: 2.5V; Output Current: 300mA; Power Supply Rejection Ratio (PSRR): 92dB@(1kHz); Voltage Dropout: 140mV@(300mA); standby current: 8.5uA; Noise: 10uVrms; Features: 使能控制；输入欠压保护；内置软启动；过流保护；短路保护；输出放电；热关断; Operating Temperature: -40℃~+125℃@(Tj); Output Type: 固定; Number of Outputs: 1
U37 U38 = TPS7A3001DGNT: 输出极性:负极;工作电压:35V;输出电压:1.179V~33V;输出电流:200mA;电源纹波抑制比(PSRR):72dB@(120Hz);输出类型:可调;; LCSC Part Name: 1.179V~33V 200mA 35V; Supplier Part: C2837783; Manufacturer: TI(德州仪器); Supplier Footprint: HVSSOP-8; JLCPCB Part Class: Extended Part; Datasheet: https://www.ti.com/cn/lit/ds/symlink/tps7a30.pdf; Supplier: LCSC; Output Configuration: 负极; Voltage - Supply: 35V; Output Voltage: 1.179V~33V; Output Current: 200mA; Power Supply Rejection Ratio (PSRR): 72dB@(120Hz); Voltage Dropout: 216mV@(100mA); standby current: 55uA; Noise: 15.1uVrms; Features: 使能控制；过流保护；可调软启动；热关断; Operating Temperature: -40℃~+125℃@(Tj); Output Type: 可调; Number of Outputs: 1
U40 = TPS7A8801RTJR: 输出极性:正极;工作电压:6.5V;输出电压:800mV~5V;输出电流:1A;电源纹波抑制比(PSRR):40dB@(1MHz);输出类型:可调;; LCSC Part Name: 800mV~5V 1A 6.5V; Supplier Part: C485919; Manufacturer: TI(德州仪器); Supplier Footprint: QFN-20-EP(4x4); JLCPCB Part Class: Extended Part; Datasheet: https://www.ti.com/cn/lit/ds/symlink/tps7a88.pdf; Supplier: LCSC; Output Configuration: 正极; Voltage - Supply: 6.5V; Output Voltage: 800mV~5V; Output Current: 1A; Power Supply Rejection Ratio (PSRR): 40dB@(1MHz); Voltage Dropout: 200mV@(1A); standby current: 3.5mA; Noise: 3.8uVrms; Features: 使能控制；工作状态指示；可调软启动；过流保护；短路保护；输出放电；热关断；输入欠压保护; Operating Temperature: -40℃~+125℃@(Tj); Output Type: 可调; Number of Outputs: 2
U43 = LMR51450SDRRR: 功能类型:降压型;工作电压:4V~36V;输出电压:800mV~28V;输出电流:5A;输出类型:可调;; LCSC Part Name: 降压型 5A 4V~36V; Supplier Part: C6890985; Manufacturer: TI(德州仪器); Supplier Footprint: WSON-12(3x3); JLCPCB Part Class: Extended Part; Datasheet: https://item.szlcsc.com/datasheet/LMR51450SDRRR/7854905.html; Supplier: LCSC; Function: 降压型; Voltage - Supply: 4V~36V; Output Voltage: 800mV~28V; Output Current: 5A; Frequency - Switching: 1.1MHz; Operating Temperature: -40℃~+150℃@(TJ); Synchronous Rectifier: 是; Number of Outputs: 1; Topology: 降压式; Quiescent Current: 25uA; Switch tube (built-in/external): 内置; Output Type: 可调; Features: 轻载高效模式；逐波限流；过流保护；EMI优化(抖频模式)；工作状态指示；打嗝限流
USB2 = TYPE-C 6P(073): 连接器类型:Type-C;标准:-;公母:母;端口数量:1;触点数量:6P;安装方式:卧贴;额定电流 - 电源:5A;工作温度范围:-25℃~+85℃;; LCSC Part Name: Type-C 母 卧贴; Supplier Part: C668623; Manufacturer: SHOU HAN(首韩); Supplier Footprint: SMD; JLCPCB Part Class: 扩展库; Datasheet: https://atta.szlcsc.com/upload/public/pdf/source/20200618/C668623_A4B260DED7AC1949BAC6AE39E9F4CD80.pdf; Supplier: LCSC; Connector Type: Type-C; Gender: 母; Number of Ports: 1; Number of Contacts: 6P; Mounting Style: 卧贴; Current Rating - Power (Max): 5A; Operating Temperature Range: -25℃~+85℃
CN3 = LAIL-SI-2.54-2X7P-ZC: 连接器类型:简牛座;间距:2.54mm;额定电流:3A;安装方式:直插;行距:2.54mm;排数:2;每排PIN数:7;触头材质:黄铜;触头镀层:金;工作温度:-40℃~+105℃;; LCSC Part Name: 2.54mm 排数:2 每排P数:7; Supplier Part: C55118369; Manufacturer: LAILAN(莱联); Supplier Footprint: 插件,P=2.54mm; JLCPCB Part Class: Extended Part; Datasheet: https://item.szlcsc.com/datasheet/LAIL-SI-2.54-2X7P-ZC/58822679.html; Supplier: LCSC; Connector Type: 简牛座; Pitch: 2.54mm; Current Rating: 3A; Holder Type: 直插; Row Spacing: 2.54mm; Number of Rows: 2; Number of PINs Per Row: 7; Contact Material: 黄铜; Contact Plating: 金; Color: 黑色; Operating Temperature: -40℃~+105℃
D1 = SS34_C7420365: 二极管配置:独立式;正向压降(Vf):550mV@3A;直流反向耐压(Vr):40V;整流电流:3A;; LCSC Part Name: 电压:40V 电流:3A; Supplier Part: C7420365; Manufacturer: R+O(宏嘉诚); Supplier Footprint: SMA(DO-214AC); JLCPCB Part Class: Extended Part; Datasheet: https://item.szlcsc.com/datasheet/SS34/8397187.html; Supplier: LCSC; Diode Configuration: 独立式; Voltage - Forward(Vf@If): 550mV@3A; Voltage - DC Reverse(Vr): 40V; Current - Rectified: 3A; Reverse Leakage Current (Ir): 200uA@40V
FPC1 = AFC01-S40FCA-00: 锁定特性:翻盖式;触点类型:下接;触点数量:40P;间距:0.5mm;安装方式:卧贴;工作温度:-45℃~+85℃;; LCSC Part Name: 翻盖式 下接 P数:40P 间距:0.5mm; Supplier Part: C262674; Manufacturer: JS(钜硕电子); Supplier Footprint: SMD,P=0.5mm,卧贴; JLCPCB Part Class: Extended Part; Datasheet: https://item.szlcsc.com/datasheet/AFC01-S40FCA-00/253933.html; Supplier: LCSC; Locking Feature: 翻盖式; Contact Type: 下接; Number of Contacts: 40P; Pitch: 0.5mm; Mounting Type: 卧贴; FFC, FCB Thickness: 0.3mm; Height Above Board: 2mm; Contact Material: 铜合金; Contact Plating: 锡; Operating Temperature: -45℃~+85℃; Rated Voltage (Max): 50V; Current Rating (Max): 500mA
RJ1 = HR911130A: 连接器类型:RJ45插座;端口数量:1;LED:带LED;屏蔽:-;等级:-;; LCSC Part Name: 带LED; Supplier Part: C54408; Manufacturer: HANRUN(汉仁); Supplier Footprint: 插件; JLCPCB Part Class: 扩展库; Datasheet: https://item.szlcsc.com/datasheet/HR911130A/55426.html; Supplier: LCSC; Connector Type: RJ45插座; Number of Ports: 1; LED: 带LED
SW1 = DSHP02TSGER_C3293142: 电路结构:单刀单掷;开关位数:2位;额定电流:25mA;额定电压:24V;工作寿命:3千次;颜色:黑色;; LCSC Part Name: 2位 1.27mm间距贴片型 KE拨码开关 编码开关; Supplier Part: C3293142; Manufacturer: 康深; Supplier Footprint: SMD,P=1.27mm; JLCPCB Part Class: Extended Part; Datasheet: https://item.szlcsc.com/datasheet/DSHP02TSGER/3856577.html; Supplier: LCSC; Circuit: 单刀单掷; Number of Positions: 2位; Lead Pitch: 1.27mm; Current Rating: 25mA; Voltage Rating: 24V; Operating Temperature: -30℃~+85℃; Operating Life: 3千次; Color: 黑色
U6 U29 = 74LVC1G125GW-TP: 工作电压:1.65V~5.5V;元件数:1;灌电流(IOL):32mA;拉电流(IOH):32mA;; LCSC Part Name: 三态输出，总线缓冲器/线路驱动器; Supplier Part: C42394076; Manufacturer: TECH PUBLIC(台舟); Supplier Footprint: SOT-353; JLCPCB Part Class: 扩展库; Datasheet: https://item.szlcsc.com/datasheet/74LVC1G125GW-TP/44333838.html; Supplier: LCSC; output type: 三态; Voltage - Supply: 1.65V~5.5V; Number of Elements: 1; Channel Type: 单向; Current - Output Low(IOL): 32mA; Current - Output High(IOH): 32mA; Logic Family: 74LVC; Operating Temperature: -40℃~+125℃; Quiescent Current: 10uA; Propagation Delay: 3ns@5V,50pF
U8 = CH340X: 应用功能:USB转串口；USB转并口;USB协议版本:USB 2.0;通道数:-;数据速率:2Mbps;; Supplier Part: C3035748; Manufacturer: WCH(南京沁恒); Supplier Footprint: MSOP-10; JLCPCB Part Class: 扩展库; Datasheet: https://item.szlcsc.com/datasheet/CH340X/3584030.html; Supplier: LCSC; Applications Function: USB转串口；USB转并口; USB Protocol: USB 2.0; Voltage - Supply: 3.3V；5V; Data Rate: 2Mbps; Operating Temperature: -40℃~+85℃
U10-U13 = M3x10+6Cu: M3x10+6; LCSC Part Name: Shuntian(顺天五金) 单头六角隔离螺柱 M3X10+6 国标 黄铜 袋装; Supplier Part: C551322; Manufacturer: Shuntian(顺天五金); JLCPCB Part Class: 扩展库; Datasheet: https://atta.szlcsc.com/upload/public/pdf/source/20200518/C357406_C09EF4431115B36F205D341EAA7D5F43.pdf; Supplier: LCSC; length: 10mm; diameter: 3mm; Thread length: 6mm; material quality: 黄铜; standard: 国标; surface treatment: 本色; Specifications: M3X10+6; structure type: 单头; Shape Type: 六角; purpose: 隔离; type: 螺柱; hexagonal opposite edge: 4.7mm
USB3 = TYPE-C 16PIN 2MD(073): 连接器类型:Type-C;协议标准:-;公母:母;安装方式:卧贴;触点数量:16P;端口数量:1;额定电流 - 电源:3A;工作温度:-25℃~+85℃;; LCSC Part Name: Type-C 母 卧贴; Supplier Part: C2765186; Manufacturer: SHOU HAN(首韩); Supplier Footprint: SMD; JLCPCB Part Class: 扩展库; Datasheet: https://item.szlcsc.com/datasheet/TYPE-C%252016PIN%25202MD(073)/2901843.html; Supplier: LCSC; Connector Type: Type-C; Gender: 母; Mounting Type: 卧贴; Number of Contacts: 16P; Number of Ports: 1; Current Rating-Power: 3A; Voltage Rating: 5V; Connect-Disconnect Life: 5千次; Detection color: 黑色; Operating Temperature: -25℃~+85℃
X1 X2 = 3710板对板连接器 公座: Supplier Part: C9900020823; Supplier Footprint: 2*50pin 0.8mm间距; JLCPCB Part Class: 扩展库; Supplier: LCSC

## Nets
3.0V: C69.2 C95.2 C97.2 C130.2 C133.2 C154.2 C155.2 L19.2 R144.1 R145.1 U21.1(IN) U21.3(EN) U24.1(IN) U24.3(EN) U34.1(IN) U34.3(EN) U40.1(IN1) U40.2(IN1) U40.4(IN2) U40.5(IN2) U40.6(EN2) U40.20(EN1)
5.0V: C60.1 C73.1 C80.2 C82.2 C92.2 C94.2 C161.2 C162.2 D1.2(K) FPC1.1 FPC1.2 L22.1 R151.1 U17.1(IN) U17.3(EN) U19.1(IN) U19.3(EN) U31.1(IN) U31.3(EN) U32.13(EN) U32.15(IN) U32.16(IN) U35.1(IN) U35.3(EN) X2.93 X2.94 X2.95 X2.96 X2.97 X2.98 X2.99 X2.100
20V-3.0V: C153.2 C156.2 R143.2 U26.3(VIN) U26.5(EN)
20V-5.1V: C158.2 C159.2 R142.2 U43.9(EN) U43.10(VIN) U43.11(VIN) U43.12(VIN)
20V--5.0V: C145.2 C157.2 R147.2 U42.3(VIN) U42.5(EN)
-5.0V: C85.2 C87.2 C145.1 C146.1 C147.1 LED7.1(K) R150.2 U37.5(EN) U37.8(IN) U38.5(EN) U38.8(IN) U42.1(GND)
A1VIN1+: U1.62(VIN+B) ; also on sheet 7
A1VIN2+: U1.61(VIN–B) ; also on sheet 7
A2VIN1+: U1.51(VIN+A) ; also on sheet 7
A2VIN2+: U1.52(VIN–A) ; also on sheet 7
GND: C1.2 C14.2 C15.1 C16.2 C18.1 C21.2 C25.2 C26.2 C27.2 C28.2 C29.2 C30.2 C31.2 C34.1 C35.2 C46.2 C47.2 C48.2 C49.2 C50.2 C51.2 C52.2 C53.2 C54.2 C55.2 C56.2 C57.2 C58.2 C59.2 C60.2 C61.2 C64.2 C69.1 C71.1 C72.1 C73.2 C74.1 C80.1 C81.1 C82.1 C83.1 C84.1 C85.1 C86.1 C87.1 C88.1 C90.1 C91.1 C92.1 C93.1 C94.1 C95.1 C96.1 C97.1 C98.1 C99.2 C100.2 C101.2 C102.2 C130.1 C131.2 C132.2 C133.1 C134.2 C135.1 C142.2 C143.2 C146.2 C147.2 C148.1 C149.2 C151.2 C153.1 C154.1 C155.1 C156.1 C157.1 C158.1 C159.1 C161.1 C162.1 CN3.1 CN3.3 CN3.5 CN3.7 CN3.9 CN3.11 CN3.13 D5.2(A) D6.2 FPC1.11 FPC1.20 FPC1.29 FPC1.41 FPC1.42 L17.2 LED5.1(K) LED8.1(K) R29.2 R63.2 R64.2 R84.1 R86.1 R88.2 R103.2 R110.1 R113.1 R114.2 R120.1 R121.1 R128.2 R131.2 R134.2 R141.1 R146.2 R148.1 R149.1 R152.2 RF5.1 RF5.2 RF5.3 RF5.4 SW1.3 SW1.4 SW4.4 SW4.5 U1.3(SYNC) U1.47(OEB) U1.56(SENSE) U1.65(EP) U2.2(CVSS) U2.5(CVSS) U2.7(DVSS) U2.28(DVSS) U2.48(DVSS) U2.58(AVSS) U2.61(AVSS) U2.64(AVSS) U2.67(AVSS) U2.70(AVSS) U2.73(PAD) U6.1(OE#) U6.3(GND) U7.4(AGND) U7.7(SYNC#/A0) U8.3(GND) U10.1 U11.1 U12.1 U13.1 U17.2(GND) U19.2(GND) U21.2(GND) U24.2(GND) U25.11(GND) U26.1(GND) U29.1(OE#) U29.3(GND) U31.2(GND) U32.2(NC) U32.7(GND) U32.8(1P6V) U32.11(0P2V) U32.12(0P1V) U32.17(NC) U32.18(NC) U32.19(NC) U32.21(EPAD) U34.2(GND) U35.2(GND) U37.4(GND) U37.9(EP) U38.4(GND) U38.9(EP) U40.3(GND) U40.8(SS_CTRL2) U40.9(PG2) U40.13(GND) U40.17(PG1) U40.18(SS_CTRL1) U40.21(EP) U43.5(PG) U43.6(RT) U43.8(AGND) U43.13(EP) USB2.7(EH) USB2.A12(GND) USB2.B12(GND) USB3.1(GND) USB3.12(GND) USB3.13(SHELL) USB3.14(SHELL) X1.24 X1.25 X1.38 X1.39 X1.89 X1.90 X2.1 X2.2 X2.3 X2.4 X2.5 X2.6 X2.7 X2.8 X2.31 X2.42 X2.49 X2.60 X2.67 X2.82 ; also on sheet 5 6 7
VBUS: C35.1 D5.1(K) R115.1 R132.2 R133.2 SW4.2 USB2.A9(VBUS) USB2.B9(VBUS)
VBUS1: Q5.2(E) Q6.3(S) R135.1 R136.1 SW4.1
VBUS-20V: Q6.2(D) R137.2 R140.2 R142.1 R143.1 R147.1
A+2.5V: C84.2 U34.5(OUT) ; also on sheet 7
A+4.5V: C1.1 C14.1 C81.2 U7.1(VDD) U31.5(OUT) ; also on sheet 7
A-2.5V: C86.2 R126.2 U37.1(OUT) ; also on sheet 7
A-4.5V: C72.2 R127.2 U38.1(OUT) ; also on sheet 7
A-AVDD1.8V: C49.1 C56.1 C57.1 C99.1 C100.1 C131.1 R85.1 U1.49(AVDD) U1.50(AVDD) U1.53(AVDD) U1.54(AVDD) U1.59(AVDD) U1.60(AVDD) U1.63(AVDD) U1.64(AVDD) U40.14(OUT1) U40.15(OUT1)
A-DVDD1.8V: C48.1 C58.1 C59.1 C101.1 C102.1 C132.1 R28.2 R87.1 U1.10(DRVDD) U1.19(DRVDD) U1.28(DRVDD) U1.37(DRVDD) U40.11(OUT2) U40.12(OUT2) ; also on sheet 5
A_CSBA: R28.1 U1.46(CSB) X1.36
A_SCLK/DFS: U1.45(SCLK/DFS) X1.34
A_SDIO/DCS: U1.44(SDIO/DCS) X1.32
ADC_A_D0(LSB): X2.40 ; also on sheet 5
ADC_A_D1: X2.38 ; also on sheet 5
ADC_A_D2: X2.36 ; also on sheet 5
ADC_A_D3: X2.34 ; also on sheet 5
ADC_A_D4: X2.32 ; also on sheet 5
ADC_A_D5: X2.30 ; also on sheet 5
ADC_A_D6: X2.28 ; also on sheet 5
ADC_A_D7: X2.26 ; also on sheet 5
ADC_A_D8: X2.24 ; also on sheet 5
ADC_A_D9: X2.22 ; also on sheet 5
ADC_A_D10: X2.20 ; also on sheet 5
ADC_A_D11: X2.18 ; also on sheet 5
ADC_A_D12: X2.17 ; also on sheet 5
ADC_A_D13: X2.16 ; also on sheet 5
ADC_A_D14: X2.13 ; also on sheet 5
ADC_A_D15: X2.14 ; also on sheet 5
ADC_B_D0(LSB): X2.21 ; also on sheet 5
ADC_B_D1: X2.54 ; also on sheet 5
ADC_B_D2: X2.53 ; also on sheet 5
ADC_B_D3: X2.52 ; also on sheet 5
ADC_B_D4: X2.50 ; also on sheet 5
ADC_B_D5: X2.48 ; also on sheet 5
ADC_B_D6: X2.47 ; also on sheet 5
ADC_B_D7: X2.46 ; also on sheet 5
ADC_B_D8: X2.45 ; also on sheet 5
ADC_B_D9: X2.44 ; also on sheet 5
ADC_B_D10: X2.43 ; also on sheet 5
ADC_B_D11: X2.41 ; also on sheet 5
ADC_B_D12: X2.39 ; also on sheet 5
ADC_B_D13: X2.37 ; also on sheet 5
ADC_B_D14: X2.35 ; also on sheet 5
ADC_B_D15: X2.33 ; also on sheet 5
ADC_CTRL_OE_N: X1.33 ; also on sheet 5
ADC_DATA_OE_N: X1.31 ; also on sheet 5
ADC_OCOA: X2.29 ; also on sheet 5
ADC_OCOB: X2.51 ; also on sheet 5
ADC_ORA: X2.27 ; also on sheet 5
ADC_ORB: X2.25 ; also on sheet 5
B13_L6N: X2.12
B13_L11_P: X2.15
B13_L15_P: X2.19
B13_L19_P: X2.11
B34_IO0      II2C_SCL: FPC1.38 X2.77
B34_IO25: X2.86
B34_L5_N       LCD_R3: FPC1.6 X2.57
B34_L5_P       LCD_R2: FPC1.5 X2.55
B34_L7_N      LCD_R4: FPC1.8 X2.62
B34_L7_P      LCD_R5: FPC1.7 X2.64
B34_L9_N       LCD_R7: FPC1.10 X2.61
B34_L9_P       LCD_R6: FPC1.9 X2.59
B34_L12_N     T_PEN: FPC1.39 X2.84
B34_L13_N      LCD_CLK: FPC1.30 X2.83
B34_L13_P    LCD_HSYNC: FPC1.31 X2.85
B34_L14_N          II2C_SDA: FPC1.36 X2.87
B34_L14_P     T_MISO: FPC1.37 X2.89
B34_L15_N       LCD_DE: FPC1.33 X2.90
B34_L15_P       LCD_VSYNC: FPC1.32 X2.88
B34_L16_N     LCD_B4: FPC1.26 X2.78
B34_L16_P     LCD_B5: FPC1.25 X2.80
B34_L17_N     LCD_G5: FPC1.16 X2.72
B34_L17_P     LCD_G4: FPC1.17 X2.70
B34_L18_N      LCD_R1: FPC1.3 X2.58
B34_L18_P      LCD_R0: FPC1.4 X2.56
B34_L19_N       LCD_B3: FPC1.24 X2.75
B34_L19_P       LCD_B2: FPC1.23 X2.73
B34_L20_N       LCD_G3: FPC1.15 X2.65
B34_L20_P       LCD_G2: FPC1.14 X2.63
B34_L21_N     LCD_G1: FPC1.12 X2.68
B34_L21_P     LCD_G0: FPC1.13 X2.66
B34_L22_N     LCD_B1: FPC1.21 X2.76
B34_L22_P     LCD_B0: FPC1.22 X2.74
B34_L23_N       LCD_B6: FPC1.27 X2.79
B34_L23_P       LCD_B7: FPC1.28 X2.81
B34_L24_N       LCD_G7: FPC1.19 X2.71
B34_L24_P       LCD_G6: FPC1.18 X2.69
B35_IO0: U2.19(P1D5) X1.55
B35_IO25: U2.20(P1D4) X1.53
B35_L1_N: X1.77 ; also on sheet 7
B35_L1_P: X1.79 ; also on sheet 7
B35_L2_N: U2.14(P1D10) X1.65
B35_L2_P: U2.13(P1D11) X1.67
B35_L3_N: U2.11(P1D13) X1.71
B35_L3_P: U2.12(P1D12) X1.69
B35_L4_N: X1.83 ; also on sheet 7
B35_L4_P: X1.81 ; also on sheet 7
B35_L5_N: U2.39(P2D7) X1.56
B35_L5_P: U2.40(P2D6) X1.54
B35_L6_N: U2.41(P2D5) X1.52
B35_L6_P: U2.42(P2D4) X1.50
B35_L7_N    LCD_BL: FPC1.34 X1.72
B35_L7_P     T_CS: FPC1.35 X1.70
B35_L8_N: X1.64 ; also on sheet 6
B35_L8_P: X1.62 ; also on sheet 6
B35_L9_N: X1.66 ; also on sheet 6
B35_L9_P: X1.68 ; also on sheet 6
B35_L10_N: U2.34(P2D12) X1.82
B35_L10_P: U2.33(P2D13) X1.84
B35_L11_N        LCD_RST: C74.2 FPC1.40 X1.51
B35_L11_P: U2.25(DCO) X1.49
B35_L12_N: U2.9(P1D15) X1.75
B35_L12_P: U2.10(P1D14) X1.73
B35_L13_N: U2.15(P1D9) X1.63
B35_L13_P: U2.16(P1D8) X1.61
B35_L14_N: R11.1 U7.6(SCLK/SCL) X1.74
B35_L14_P: R10.1 U7.8(SDIN/SDA) X1.76
B35_L15_N: X1.87 ; also on sheet 7
B35_L15_P: X1.85 ; also on sheet 7
B35_L16_N: U2.37(P2D9) X1.60
B35_L16_P: U2.38(P2D8) X1.58
B35_L17_N: U2.32(P2D14) X1.86
B35_L17_P: U2.31(P2D15) X1.88
B35_L18_N: U2.36(P2D10) X1.78
B35_L18_P: U2.35(P2D11) X1.80
B35_L19_N: U2.17(P1D7) X1.59
B35_L19_P: U2.18(P1D6) X1.57
B35_L20_N: U2.21(P1D3) X1.47
B35_L20_P: U2.22(P1D2) X1.45
B35_L21_N: U2.45(P2D1) X1.42
B35_L21_P: U2.46(P2D0) X1.40
B35_L22_N: U2.43(P2D3) X1.46
B35_L22_P: U2.44(P2D2) X1.44
B35_L23_N: U2.23(P1D1) X1.43
B35_L23_P: U2.24(P1D0) X1.41
B35_L24_P: X1.48 ; also on sheet 7
CC1: R114.1 U25.7(CC1) USB2.A5(CC1)
CC2: R134.1 U25.6(CC2) USB2.B5(CC2)
CH-3.3V: C16.1 C27.1 C28.1 C83.2 CN3.2 R19.1 R20.1 R104.2 RJ1.11 RJ1.14 U6.5(VCC) U8.7(VCC) U8.10(V3) U29.5(VCC) U35.5(OUT) ; also on sheet 5 6
CLKN: U2.4(CLKN) ; also on sheet 6
CLKN-ADC: C90.2 U1.2(CLK–) ; also on sheet 6
CLKP: U2.3(CLKP) ; also on sheet 6
CLKP-ADC: U1.1(CLK+) ; also on sheet 6
CS: X1.8 ; also on sheet 6
CSBD: R104.1 U2.52(CSB) X1.10
D0A(LSB): U1.25(D0A(LSB)) ; also on sheet 5
D0B(LSB): U1.4(D0B(LSB)) ; also on sheet 5
D1A: U1.26(D1A) ; also on sheet 5
D1B: U1.5(D1B) ; also on sheet 5
D2A: U1.27(D2A) ; also on sheet 5
D2B: U1.6(D2B) ; also on sheet 5
D3A: U1.29(D3A) ; also on sheet 5
D3B: U1.7(D3B) ; also on sheet 5
D4A: U1.30(D4A) ; also on sheet 5
D4B: U1.8(D4B) ; also on sheet 5
D5A: U1.31(D5A) ; also on sheet 5
D5B: U1.9(D5B) ; also on sheet 5
D6A: U1.32(D6A) ; also on sheet 5
D6B: U1.11(D6B) ; also on sheet 5
D7A: U1.33(D7A) ; also on sheet 5
D7B: U1.12(D7B) ; also on sheet 5
D8A: U1.34(D8A) ; also on sheet 5
D8B: U1.13(D8B) ; also on sheet 5
D9A: U1.35(D9A) ; also on sheet 5
D9B: U1.14(D9B) ; also on sheet 5
D10A: U1.36(D10A) ; also on sheet 5
D10B: U1.15(D10B) ; also on sheet 5
D11A: U1.38(D11A) ; also on sheet 5
D11B: U1.16(D11B) ; also on sheet 5
D12A: U1.39(D12A) ; also on sheet 5
D12B: U1.17(D12B) ; also on sheet 5
D13A: U1.40(D13A) ; also on sheet 5
D13B: U1.18(D13B) ; also on sheet 5
D14A: U1.41(D14A) ; also on sheet 5
D14B: U1.20(D14B) ; also on sheet 5
D15A: U1.42(D15A(MSB)) ; also on sheet 5
D15B: U1.21(D15B(MSB)) ; also on sheet 5
D+: U8.1(UD+) USB3.6(DP1) USB3.8(DP2)
D-: U8.2(UD-) USB3.5(DN2) USB3.7(DN1)
D-AVDD3.3V: C30.1 C31.1 C46.1 C91.2 R9.2 R10.2 R11.2 U2.56(AVDD33) U2.57(AVDD33) U2.71(AVDD33) U2.72(AVDD33) U17.5(OUT)
D-CVDD1.8V: C53.1 C54.1 C96.2 U2.1(CVDD18) U2.6(CVDD18) U21.5(OUT)
D-DVDD1.8V: C50.1 C51.1 C98.2 U2.8(DVDD18) U2.47(DVDD18) U24.5(OUT)
D-DVDD3.3V: C47.1 C52.1 C93.2 U2.27(DVDD33) U19.5(OUT)
D_RESET: R29.1 U2.53(RESET) X1.7
DAC3: R26.2 ; also on sheet 7
DCLK3.3V: C55.1 U32.1(OUT) U32.3(SENSE/FB) U32.20(OUT) ; also on sheet 6
DCOA: U1.24(DCOA) ; also on sheet 5
DCOB: U1.23(DCOB) ; also on sheet 5
FB: R151.2 R152.1 U43.7(FB)
FPGATCK: R117.2 X1.2
FPGATDI: R119.2 X1.3
FPGATDO: R118.2 X1.4
FPGATMS: R116.2 X1.1
FSADJ: R88.1 U2.54(FSADJ)
IOUT1N: U2.68(IOUT1N) ; also on sheet 7
IOUT1P: U2.69(1OUT1P) ; also on sheet 7
IOUT2N: U2.60(1OUT2N) ; also on sheet 7
IOUT2P: U2.59(1OUT2P) ; also on sheet 7
IQSEL: U2.29(IQSEL) X1.11
LD: X2.23 ; also on sheet 6
ORA: U1.43(ORA) ; also on sheet 5
ORB: U1.22(ORB) ; also on sheet 5
OTG_CLK: X1.30
OTG_DATA2: X1.29
OTG_DATA3: X1.26
OTG_DATA4: X1.35
OTG_DATA5: X1.27
OTG_DATA6: X1.28
OTG_DATA7: X1.37
PDWN: R64.1 U1.48(PDWN)
PG: LED1.1(K) U25.10(PG)
PHY1AD0/LED0: R112.1 X1.100
PHY1AD1/LED1: R111.2 X1.99
PHY1MDI0N: RJ1.P3(MDI0-) X1.96
PHY1MDI0P: RJ1.P2(MDI0+) X1.98
PHY1MDI1N: RJ1.P7(MDI1-) X1.92
PHY1MDI1P: RJ1.P4(MDI1+) X1.94
PHY1MDI2N: RJ1.P6(MDI2-) X1.95
PHY1MDI2P: RJ1.P5(MDI2+) X1.97
PHY1MDI3N: RJ1.P9(MDI3-) X1.91
PHY1MDI3P: RJ1.P8(MDI3+) X1.93
PS_MIO7: U2.51(SCLK) X1.9 ; also on sheet 6
PS_MIO8: U2.50(SDIO) X1.6 ; also on sheet 6
PS_MIO9: U2.49(SDO) X1.5 ; also on sheet 6
QSPI_D2   BOOT MODE0: R18.1 X1.20
QSPI_D3   BOOT MODE1: R15.1 X1.22
RBIAS: R63.1 U1.58(RBIAS)
REFIO: C64.1 U2.55(REFIO)
RXD: U8.9(RXD) U29.4(Y)
SD_CLK: X1.21
SD_CMD: X1.23
SD_D0: X1.19
SD_D1: X1.17
SD_D2: X1.15
SD_D3: X1.13
TXD: U6.2(A) U8.8(TXD)
TYPEC5V: D1.1(A) USB3.2(VBUS) USB3.11(VBUS)
UART1RXD   PS_MIO14: U6.4(Y) X1.12
UART1TXD   PS_MIO15: U29.2(A) X1.14
VCM: C21.1 C29.1 U1.57(VCM) ; also on sheet 7
VOUT: R26.1 R33.2 U7.2(VOUT)
VREF: C25.1 C26.1 U1.55(VREF)
XADC_VN: X1.18
XADC_VP: X1.16
$C15_2: C15.2 U7.10(VREFIO)
$C18_2: C18.2 C34.2 RJ1.P1
$C61_1: C61.1 U32.14(NR)
$C71_2: C71.2 U37.6(NR/SS)
$C88_2: C88.2 U38.6(NR/SS)
$C134_1: C134.1 U40.19(NR/SS1)
$C135_2: C135.2 U40.7(NR/SS2)
$C142_1: C142.1 R111.1 RJ1.12
$C143_1: C143.1 R112.2 RJ1.13
$C144_1: C144.1 L17.1 U42.2(SW)
$C144_2: C144.2 U42.6(CB)
$C148_2: C148.2 R132.1 U25.1(VDD)
$C149_1: C149.1 R135.2
$C150_1: C150.1 Q5.1(B) R138.2
$C150_2: C150.2 Q5.3(C) R139.1 R141.2
$C151_1: C151.1 R137.1
$C152_1: C152.1 L19.1 U26.2(SW)
$C152_2: C152.2 U26.6(CB)
$C160_1: C160.1 L22.2 U43.1(SW) U43.2(SW) U43.3(SW)
$C160_2: C160.2 U43.4(BOOT)
$CN3_4: CN3.4 R116.1
$CN3_6: CN3.6 R117.1
$CN3_8: CN3.8 R118.1
$CN3_10: CN3.10 R119.1
$D6_1: D6.1 R136.2 R138.1
$LED1_2: LED1.2(A) R115.2
$LED5_2: LED5.2(A) R144.2
$LED7_2: LED7.2(A) R148.2
$LED8_2: LED8.2(A) R140.1
$Q6_1: Q6.1(G) R139.2
$R9_1: R9.1 U7.5(SPI2C)
$R15_2: R15.2 R20.2 SW1.2
$R18_2: R18.2 R19.2 SW1.1
$R33_1: R33.1 RF5.5
$R84_2: R84.2 R85.2 U40.16(FB1)
$R86_2: R86.2 R87.2 U40.10(FB2)
$R103_1: R103.1 R126.1 U37.2(FB)
$R110_2: R110.2 RJ1.SHIELD0 RJ1.SHIELD1
$R113_2: R113.2 RJ1.P10
$R120_2: R120.2 USB3.4(CC1)
$R121_2: R121.2 USB3.10(CC2)
$R127_1: R127.1 R128.1 U38.2(FB)
$R131_1: R131.1 U25.9(CFG1)
$R133_1: R133.1 U25.8(VBUS)
$R145_2: R145.2 R146.1 U26.4(FB)
$R149_2: R149.2 R150.1 U42.4(FB)

Not connected (* = marked no-connect by the designer): CN3 12 14; SW4 3; U2 26(DNC) 30(DNC) 62(AUX2P) 63(AUX2N) 65(AUX1N) 66(AUX1P); U7 3(NC) 9(NC); U8 4(RTS#) 5(CTS#) 6(TNOW/DTR#); U17 4(NC); U19 4(NC); U21 4(N/C); U24 4(N/C); U25 2(CFG2) 3(CFG3) 4(DP) 5(DM); U31 4(N/C); U32 4(6P4V2) 5(6P4V1) 6(3P2V) 9(0P8V) 10(0P4V); U34 4(N/C); U35 4(NC); U37 3(NC) 7(DNC); U38 3(NC) 7(DNC); USB3 3(SBU2) 9(SBU1); X2 9 10 91 92

## Notes on the sheets
sheet 1
- ADC
- DAC
- B通道过量程输出
- A通道过量程输出
- 上拉I2C
sheet 2
- AFE
- AFE
- AFE
- AFE
- AD9268
- -125
- AD9747
- AD9516-3
- Level-Shifter
- JTAG
- RGB
- LCD
- PM
- ZYNQ7020
- 核心板
- USB
- ETHERNET(PS)
- UART
sheet 3
- 20 V PD输入
  │
  ├── DCDC +5.0 V
  │   ├── Zynq核心板
  │   │   └── 5.0 W / 1.00 A
  │   │
  │   ├── TPS7A2045 → +A4.5 V → 6×LMH6609正电源
  │   │   └── 51 mA；负载0.230 W；+5V侧0.255 W
  │   │
  │   ├── TPS7A2033 → A3.3 V → AD9747 AVDD33
  │   │   └── 60 mA；负载0.198 W；+5V侧0.300 W
  │   │
  │   ├── TPS7A2033 → D3.3 V → AD9747 DVDD33
  │   │   └── 16 mA；负载0.053 W；+5V侧0.080 W
  │   │
  │   ├── TPS7A2033 → CH-3.3 V
  │   │   ├── CH340
  │   │   └── 电平转换器B侧
  │   │       └── 按200 mA预算；负载0.660 W；+5V侧1.000 W
  │   │
  │   └── TPS7A4701 → DCLK3.3 V → AD9516-3
  │       ├── 典型：约0.36 A；负载约1.2 W；+5V侧约1.82 W
  │       └── 最坏：约0.70 A；负载约2.3 W；+5V侧约3.49 W
  │
  │   DCDC +5V合计：
  │   └── 约8.46～10.13 W，约1.69～2.03 A
  │
  ├── DCDC +3.0 V
  │   ├── TPS7A2025 → +A2.5 V → 2×LMH6554正电源
  │   │   └── 114 mA；负载0.285 W；+3V侧0.342 W
  │   │
  │   ├── TPS7A8801 OUT1 → A-AVDD1.8 V → AD9268 AVDD
  │   │   └── 400 mA；负载0.720 W；+3V侧1.200 W
  │   │
  │   ├── TPS7A8801 OUT2 → A-DVDD1.8 V
  │   │   ├── AD9268 DRVDD：55 mA
  │   │   └── 3片电平转换器VCCA：按200 mA预留
  │   │       └── 合计255 mA；负载0.459 W；+3V侧0.765 W
  │   │
  │   ├── TPS7A2018 → AD9747 CVDD18
  │   │   └── 22 mA；负载0.040 W；+3V侧0.066 W
  │   │
  │   └── TPS7A2018 → AD9747 DVDD18
  │       └── 36 mA；负载0.065 W；+3V侧0.108 W
  │
  │   DCDC +3V合计：
  │   └── 约2.48 W，约0.83 A
  │
  └── DCDC −5.0 V
      ├── TPS7A3001 → −A4.5 V → 6×LMH6609负电源
      │   └── 51 mA；负载0.230 W；−5V侧0.255 W
      │
      └── TPS7A3001 → −A2.5 V → 2×LMH6554负电源
          └── 114 mA；负载0.285 W；−5V侧0.570 W
      DCDC −5V合计：
      └── 约0.825 W，约0.165 A
- TYPE-C接口
- 20V转5.0V 4A
- PD协议
- 20V转3V 1.5A
- 软启动、过压
- 20V转-5V 1A
- 5.0V转3.3V 300mA
- LMH6609
- 3.0V转1.8V 1A×2
- AD9268
- 5.0V转3.3V 300mA
- 3.0V转1.8V 300mA
- LMH6554
- 1A
- 3.0V转1.8V 300mA
- 5.0V转3.3V 1A
- CH340
- AD9516-3
- AD9747
sheet 4
- USB-UART
- JTAG
- 3.3V
- RGB_LCD
- 核心板
- BOOT OPTION
- 网口
